# EasyEDA Pro project easyedapro_openstm.epro

# Schematic ControlBoard

## Sheets
1 P1: Create Date: 2023-06-15; Page Name: P1; Project Name: 扫描隧道显微镜OpenSTM; Schematic Name: ControlBoard; Update Date: 2023-06-15; Add into BOM: yes; Convert to PCB: yes
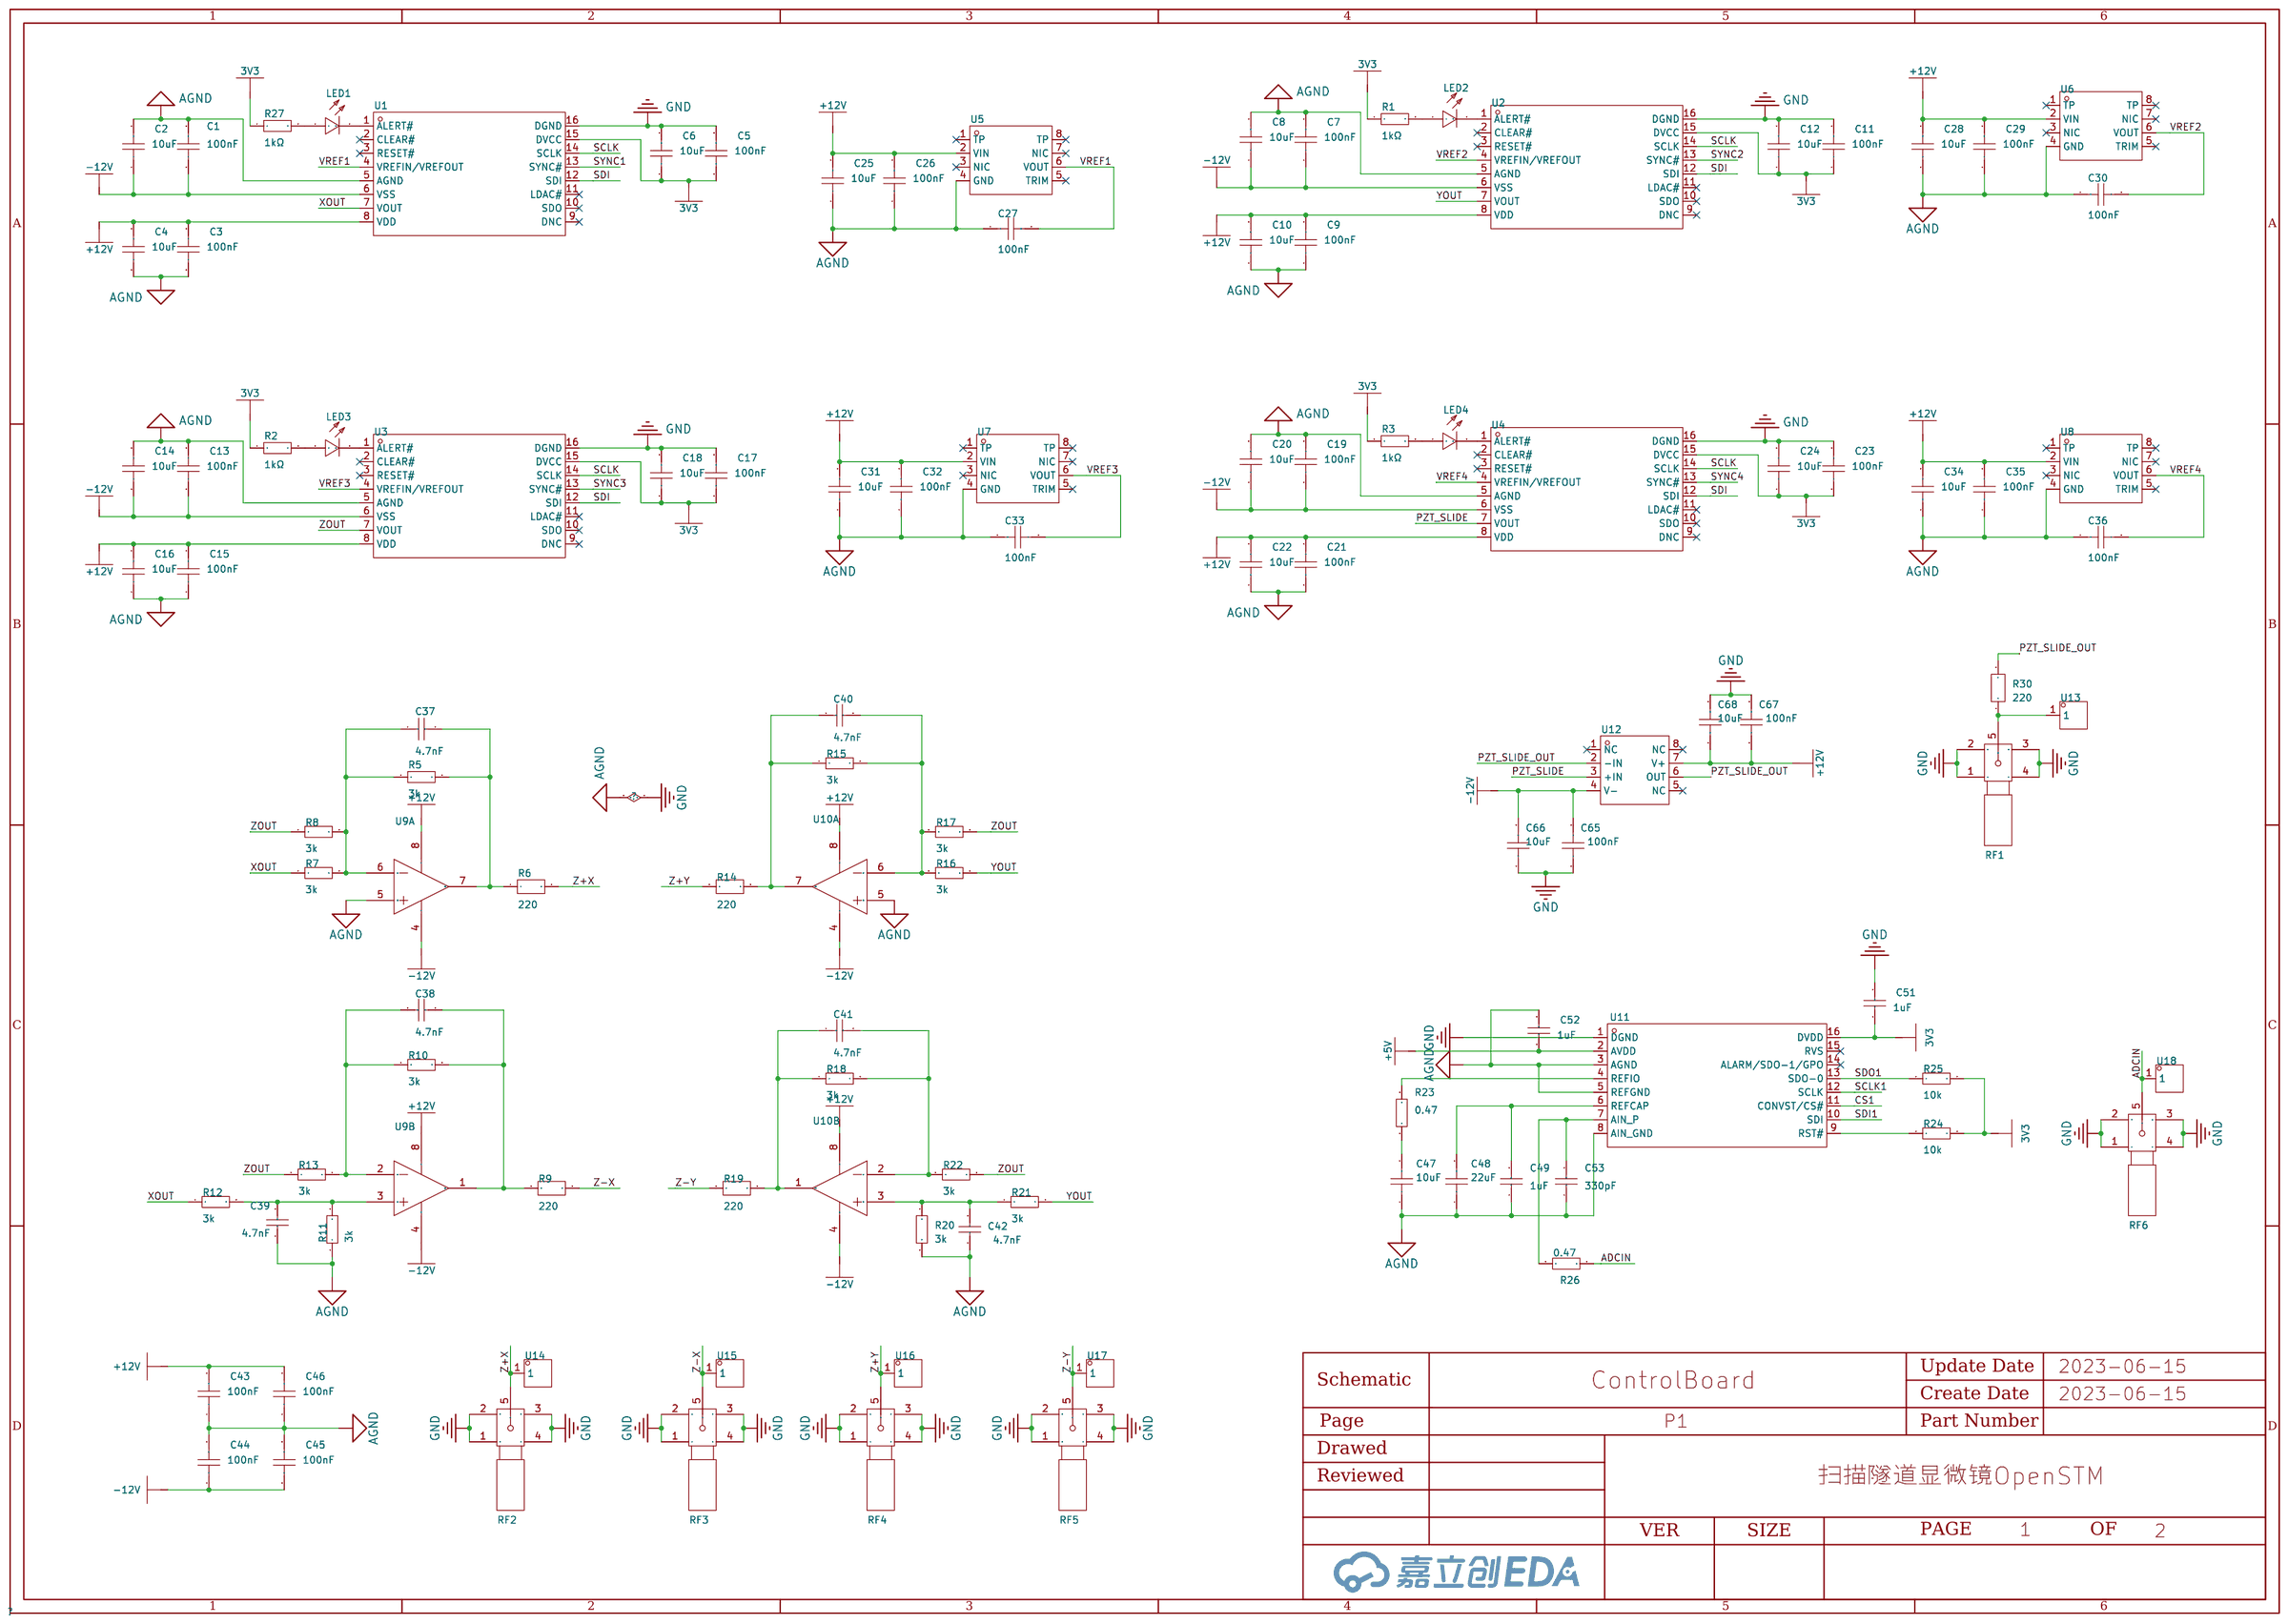
[diagram p0: P1]
2 P2: Create Date: 2022-03-08; Page Name: P2; Project Name: STM-New-Structure; Update Date: 2023-01-28
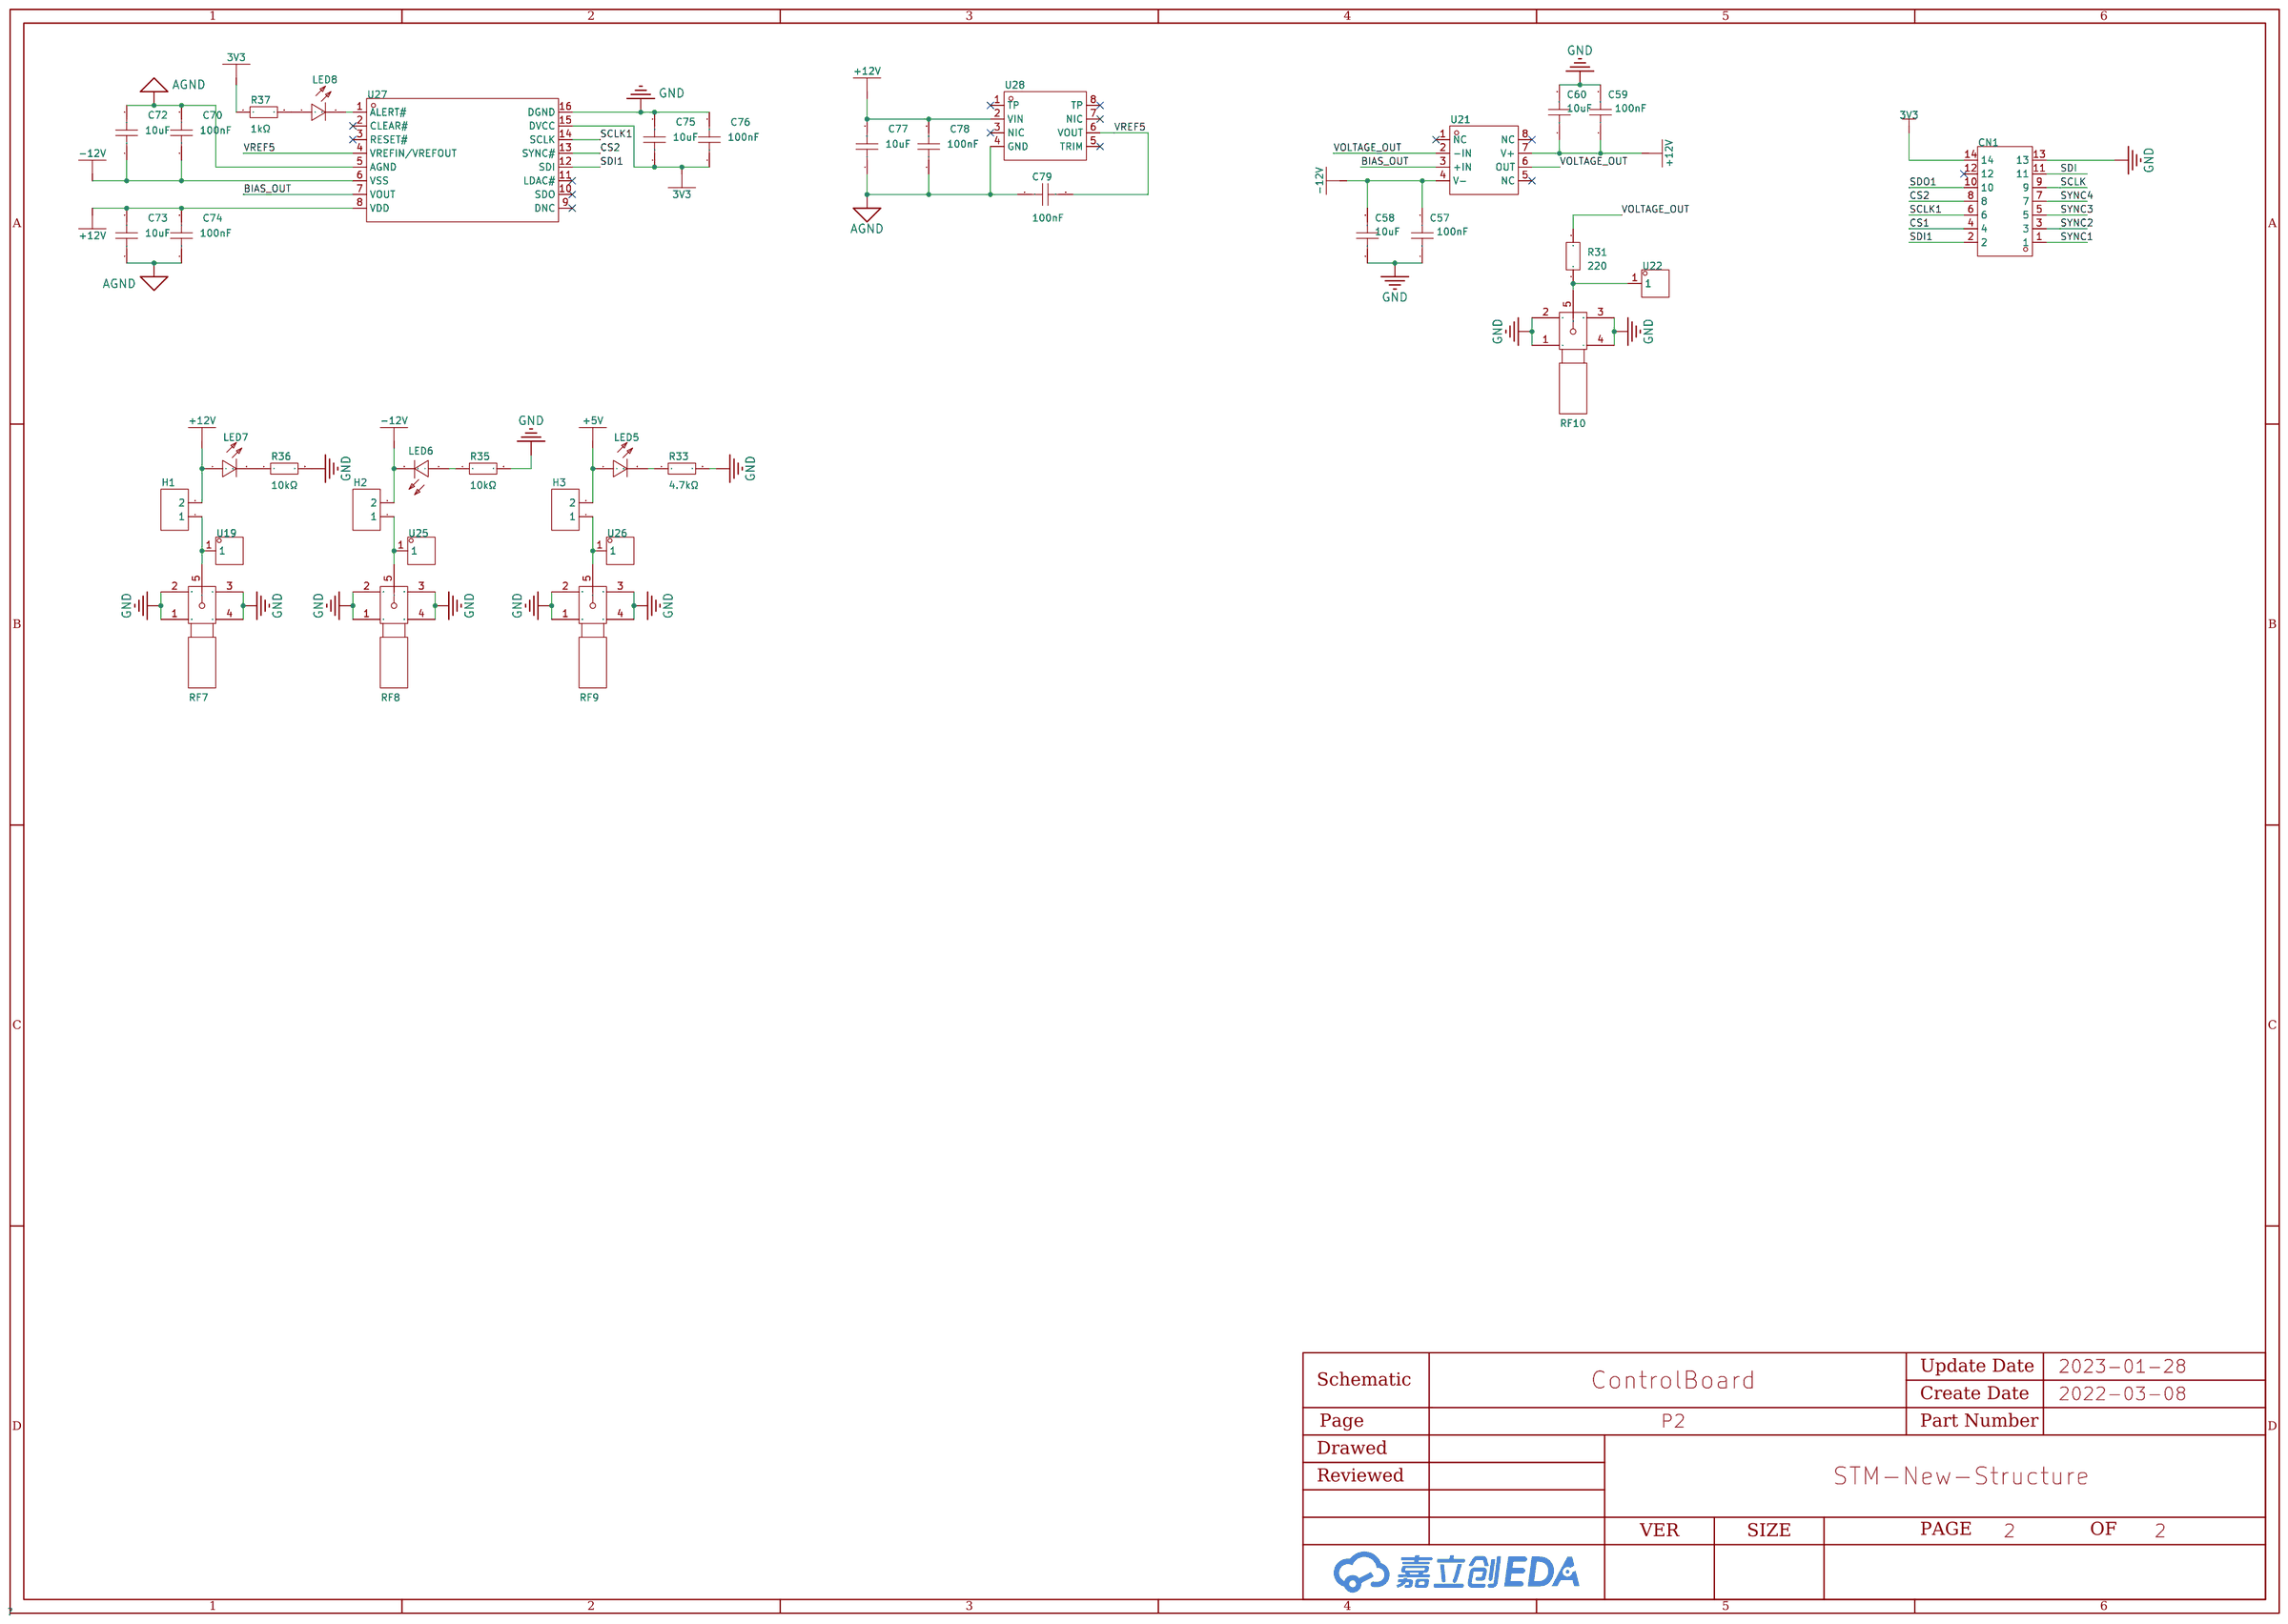
[diagram p1: P2]

## Parts
sheet P1
C1  100nF  [C0603]
C2  10uF  [C0603]
C3  100nF  [C0603]
C4  10uF  [C0603]
C5  100nF  [C0603]
C6  10uF  [C0603]
C7  100nF  [C0603]
C8  10uF  [C0603]
C9  100nF  [C0603]
C10  10uF  [C0603]
C11  100nF  [C0603]
C12  10uF  [C0603]
C13  100nF  [C0603]
C14  10uF  [C0603]
C15  100nF  [C0603]
C16  10uF  [C0603]
C17  100nF  [C0603]
C18  10uF  [C0603]
C19  100nF  [C0603]
C20  10uF  [C0603]
C21  100nF  [C0603]
C22  10uF  [C0603]
C23  100nF  [C0603]
C24  10uF  [C0603]
C25  10uF  [C0603]
C26  100nF  [C0603]
C27  100nF  [C0603]
C28  10uF  [C0603]
C29  100nF  [C0603]
C30  100nF  [C0603]
C31  10uF  [C0603]
C32  100nF  [C0603]
C33  100nF  [C0603]
C34  10uF  [C0603]
C35  100nF  [C0603]
C36  100nF  [C0603]
C37  4.7nF  [C0603]
C38  4.7nF  [C0603]
C39  4.7nF  [C0603]
C40  4.7nF  [C0603]
C41  4.7nF  [C0603]
C42  4.7nF  [C0603]
C43  100nF  [C0603]
C44  100nF  [C0603]
C45  100nF  [C0603]
C46  100nF  [C0603]
C47  10uF  [C0603]
C48  22uF  [C0603]
C49  1uF  [C0603]
C51  1uF  [C0603]
C52  1uF  [C0603]
C53  330pF  [C0603]
C65  100nF  [C0603]
C66  10uF  [C0603]
C67  100nF  [C0603]
C68  10uF  [C0603]
LED1  -  [LED0603-R-RD]
LED2  -  [LED0603-R-RD]
LED3  -  [LED0603-R-RD]
LED4  -  [LED0603-R-RD]
R1  1kΩ  [R0603]
R2  1kΩ  [R0603]
R3  1kΩ  [R0603]
R5  3k  [R0603]
R6  220  [R0603]
R7  3k  [R0603]
R8  3k  [R0603]
R9  220  [R0603]
R10  3k  [R0603]
R11  3k  [R0603]
R12  3k  [R0603]
R13  3k  [R0603]
R14  220  [R0603]
R15  3k  [R0603]
R16  3k  [R0603]
R17  3k  [R0603]
R18  3k  [R0603]
R19  220  [R0603]
R20  3k  [R0603]
R21  3k  [R0603]
R22  3k  [R0603]
R23  0.47  [R0603]
R24  10k  [R0603]
R25  10k  [R0603]
R26  0.47  [R0603]
R27  1kΩ  [R0603]
R30  220  [R0603]
RF1  -  [SMA-TH_KH-SMA-KE-Z]
RF2  -  [SMA-TH_KH-SMA-KE-Z]
RF3  -  [SMA-TH_KH-SMA-KE-Z]
RF4  -  [SMA-TH_KH-SMA-KE-Z]
RF5  -  [SMA-TH_KH-SMA-KE-Z]
RF6  -  [SMA-TH_KH-SMA-KE-Z]
U1  -  [TSSOP-16_L5.0-W4.4-P0.65-LS6.4-TL]
U2  -  [TSSOP-16_L5.0-W4.4-P0.65-LS6.4-TL]
U3  -  [TSSOP-16_L5.0-W4.4-P0.65-LS6.4-TL]
U4  -  [TSSOP-16_L5.0-W4.4-P0.65-LS6.4-TL]
U5  -  [SOIC-8_L4.9-W3.9-P1.27-LS6.0-BL]
U6  -  [SOIC-8_L4.9-W3.9-P1.27-LS6.0-BL]
U7  -  [SOIC-8_L4.9-W3.9-P1.27-LS6.0-BL]
U8  -  [SOIC-8_L4.9-W3.9-P1.27-LS6.0-BL]
U9  -  [SOIC-8_L4.9-W3.9-P1.27-LS6.0-BL]  (sections 1,2)
U10  -  [SOIC-8_L4.9-W3.9-P1.27-LS6.0-BL]  (sections 1,2)
U11  -  [TSSOP-16_L5.0-W4.4-P0.65-LS6.4-TL]
U12  -  [SOIC-8_L4.9-W3.9-P1.27-LS6.0-BL]
U13  -  [TEST-SMD_L2.7-W1.0]
U14  -  [TEST-SMD_L2.7-W1.0]
U15  -  [TEST-SMD_L2.7-W1.0]
U16  -  [TEST-SMD_L2.7-W1.0]
U17  -  [TEST-SMD_L2.7-W1.0]
U18  -  [TEST-SMD_L2.7-W1.0]
sheet P2
C57  100nF  [C0603]
C58  10uF  [C0603]
C59  100nF  [C0603]
C60  10uF  [C0603]
C70  100nF  [C0603]
C72  10uF  [C0603]
C73  10uF  [C0603]
C74  100nF  [C0603]
C75  10uF  [C0603]
C76  100nF  [C0603]
C77  10uF  [C0603]
C78  100nF  [C0603]
C79  100nF  [C0603]
CN1  X9555WR-2x07-6TV01  [CONN-TH_14P-P2.54_XKB_X9555WR-2X7-6TV01]
H1  -  [HDR-TH_2P-P2.54-V-F]
H2  -  [HDR-TH_2P-P2.54-V-F]
H3  -  [HDR-TH_2P-P2.54-V-F]
LED5  -  [LED0603-R-RD]
LED6  -  [LED0603-R-RD]
LED7  -  [LED0603-R-RD]
LED8  -  [LED0603-R-RD]
R31  220  [R0603]
R33  4.7kΩ  [R0603]
R35  10kΩ  [R0603]
R36  10kΩ  [R0603]
R37  1kΩ  [R0603]
RF7  -  [SMA-TH_KH-SMA-KE-Z]
RF8  -  [SMA-TH_KH-SMA-KE-Z]
RF9  -  [SMA-TH_KH-SMA-KE-Z]
RF10  -  [SMA-TH_KH-SMA-KE-Z]
U19  -  [TEST-SMD_L2.7-W1.0]
U21  AD8671ARZ-REEL7  [SOIC-8_L4.9-W3.9-P1.27-LS6.0-BL]
U22  -  [TEST-SMD_L2.7-W1.0]
U25  -  [TEST-SMD_L2.7-W1.0]
U26  -  [TEST-SMD_L2.7-W1.0]
U27  AD5721RBRUZ-RL7  [TSSOP-16_L5.0-W4.4-P0.65-LS6.4-BL]
U28  -  [SOIC-8_L4.9-W3.9-P1.27-LS6.0-BL]

## Library data of the parts
C1 C3 C5 C7 C9 C11 C13 C15 C17 C19 C21 C23 C26 C27 C29 C30 C32 C33 C35 C36 C43-C46 C57 C59 C65 C67 C70 C74 C76 C78 C79 = CL10B104KA8NNNC: 容值:100nF;精度:±10%;额定电压:25V;温度系数:X7R;; LCSC Part Name: 100nF±10%25V; Supplier Part: C1590; Manufacturer: SAMSUNG(三星); Supplier Footprint: 0603; JLCPCB Part Class: ExtendedPart; Datasheet: https://atta.szlcsc.com/upload/public/pdf/source/20160103/1457707680294.pdf; Supplier: LCSC; Tolerance: ±10%; Voltage Rated: 25V; Temperature Coefficient: X7R
C2 C4 C6 C8 C10 C12 C14 C16 C18 C20 C22 C24 C25 C28 C31 C34 C47 C58 C60 C66 C68 C72 C73 C75 C77 = GRM188R61E106MA73D: 容值:10uF;精度:±20%;额定电压:25V;温度系数:X5R;; LCSC Part Name: 10uF±20%25V; Supplier Part: C91606; Manufacturer: muRata(村田); Supplier Footprint: 0603; JLCPCB Part Class: ExtendedPart; Datasheet: https://atta.szlcsc.com/upload/public/pdf/source/20161226/1482720176185.pdf; Supplier: LCSC; Tolerance: ±20%; Voltage Rated: 25V; Temperature Coefficient: X5R
C37-C42 = 0603B472K500NT: 容值:4.7nF;精度:±10%;额定电压:50V;材质(温度系数):X7R;; LCSC Part Name: 4.7nF±10%50V; Supplier Part: C53987; Manufacturer: FH(风华); Supplier Footprint: 0603; JLCPCB Part Class: BasicPart; Datasheet: https://atta.szlcsc.com/upload/public/pdf/source/20170923/C53987_1506149489951988835.pdf; Supplier: LCSC; Tolerance: ±10%; Voltage Rated: 50V; Temperature Coefficient: X7R
C48 = CL10A226MP8NUNE: 容值:22uF;精度:±20%;额定电压:10V;温度系数:X5R;; LCSC Part Name: 22uF±20%10V; Supplier Part: C86295; Manufacturer: SAMSUNG(三星); Supplier Footprint: 0603; JLCPCB Part Class: ExtendedPart; Datasheet: https://atta.szlcsc.com/upload/public/pdf/source/20170325/1490427882169.pdf; Supplier: LCSC; Tolerance: ±20%; Voltage Rated: 10V; Temperature Coefficient: X5R
C49 C51 C52 = CL10A105KA8NNNC: 容值:1uF;精度:±10%;额定电压:25V;温度系数:X5R;; LCSC Part Name: 1uF±10%25V; Supplier Part: C5673; Manufacturer: SAMSUNG(三星); Supplier Footprint: 0603; JLCPCB Part Class: ExtendedPart; Datasheet: https://atta.szlcsc.com/upload/public/pdf/source/20160103/1457707739994.pdf; Supplier: LCSC; Tolerance: ±10%; Voltage Rated: 25V; Temperature Coefficient: X5R
C53 = CL10C331JB8NNNC: 容值:330pF;精度:±5%;额定电压:50V;温度系数:C0G;; LCSC Part Name: 330pF±5%50V; Supplier Part: C1664; Manufacturer: SAMSUNG(三星); Supplier Footprint: 0603; JLCPCB Part Class: BasicPart; Datasheet: https://atta.szlcsc.com/upload/public/pdf/source/20160103/1457707688612.pdf; Supplier: LCSC; Tolerance: ±5%; Voltage Rated: 50V; Temperature Coefficient: C0G
LED1-LED8 = 19-217/R6C-AL1M2VY/3T: 发光颜色:红灯;二极管配置:-;透镜颜色:无色透明;主波长:617.5nm;峰值波长:632nm;色温:-;光通量(25时):-;测试电流:5mA;正向电压(VF):2.2V;发光强度:28.5mcd;功率:60mW;发光角度:120°;安装方式:-;工作温度:-40~+85;; LCSC Part Name: 0603红灯; Supplier Part: C72044; Manufacturer: EVERLIGHT(台湾亿光); Supplier Footprint: 0603; JLCPCB Part Class: ExtendedPart; Datasheet: https://atta.szlcsc.com/upload/public/pdf/source/20160507/1462613613821.pdf; Supplier: LCSC; Emitted Color: 红灯; Lens Color: 无色透明; Dominant Wavelength: 617.5nm; Peak Wavelength: 632nm; Forward Current: 5mA; Forward Voltage (VF): 2.2V; Luminous Intensity: 28.5mcd; Power Dissipation: 60mW; Viewing Angle: 120°; Operating Temperature: -40~+85
R1-R3 R27 R37 = 0603WAF1001T5E: 电阻类型:厚膜电阻;阻值:1kΩ;精度:±1%;功率:100mW;温度系数:±100ppm/℃;最大工作电压:75V;工作温度范围:-55℃~+155℃;; LCSC Part Name: 1kΩ±1%100mW; Supplier Part: C21190; Manufacturer: UNI-ROYAL(厚声); Supplier Footprint: 0603; JLCPCB Part Class: BasicPart; Datasheet: https://atta.szlcsc.com/upload/public/pdf/source/20200306/C422600_1E6D84923E4A46A82E41ADD87F860B5C.pdf; Supplier: LCSC; Type: 厚膜电阻; Tolerance: ±1%; Power(Watts): 100mW; Temperature Coefficient: ±100ppm/℃; Overload Voltage (Max): 75V; Operating Temperature Range: -55℃~+155℃
R5 R7 R8 R10-R13 R15-R18 R20-R22 = ARG03DTC3001: 电阻类型:薄膜电阻;阻值:3k;精度:±0.5%;功率:100mW;温度系数:±25ppm/;最大工作电压:75V;工作温度范围:-55~+155;; LCSC Part Name: 3k ±0.5% 100mW; Supplier Part: C311916; Manufacturer: 光颉(Viking); Supplier Footprint: 0603; JLCPCB Part Class: ExtendedPart; Datasheet: https://atta.szlcsc.com/upload/public/pdf/source/20181119/C311916_083AB72433BF5B624DBE6C035DD51480.pdf; Supplier: LCSC; Type: 薄膜电阻; Tolerance: ±0.5%; Power(Watts): 100mW; Temperature Coefficient: ±25ppm/; Overload Voltage (Max): 75V; Operating Temperature Range: -55~+155
R6 R9 R14 R19 R30 R31 = ERJU3RD2200V: 阻值:220;精度:±0.5%;功率:100mW;温度系数:±50ppm/;最大工作电压:-;工作温度范围:-55~+155;; LCSC Part Name: 220 ±0.5% 100mW; Supplier Part: C491169; Manufacturer: PANASONIC(松下); Supplier Footprint: 0603; JLCPCB Part Class: ExtendedPart; Datasheet: https://atta.szlcsc.com/upload/public/pdf/source/20200407/C491169_AC2E94AF70820CF85EC0143B46F9F0DA.pdf; Supplier: LCSC; Tolerance: ±0.5%; Power(Watts): 100mW; Temperature Coefficient: ±50ppm/; Operating Temperature Range: -55~+155
R23 R26 = RL0603FR-070R47L: 阻值:0.47;精度:±1%;功率:100mW;温度系数:±800ppm/;; LCSC Part Name: 0.47 ±1% 100mW; Supplier Part: C326953; Manufacturer: YAGEO(国巨); Supplier Footprint: 0603; JLCPCB Part Class: ExtendedPart; Datasheet: https://atta.szlcsc.com/upload/public/pdf/source/20181031/C326953_2A06D5EACD581F8EE6DB7FFE6C5B8872.pdf; Supplier: LCSC; Tolerance: ±1%; Power(Watts): 100mW; Temperature Coefficient: ±800ppm/
R24 R25 = 0603WAF1002T5E: 电阻类型:厚膜电阻;阻值:10k;精度:±1%;功率:1/10W;温度系数:±100ppm/;最大工作电压:75V;工作温度范围:-55~+155;; LCSC Part Name: 10k ±1%; Supplier Part: C25804; Manufacturer: UNI-ROYAL(厚声); Supplier Footprint: 0603; JLCPCB Part Class: BasicPart; Datasheet: https://atta.szlcsc.com/upload/public/pdf/source/20200306/C422600_1E6D84923E4A46A82E41ADD87F860B5C.pdf; Supplier: LCSC; Type: 厚膜电阻; Tolerance: ±1%; Power(Watts): 1/10W; Temperature Coefficient: ±100ppm/; Overload Voltage (Max): 75V; Operating Temperature Range: -55~+155
RF1-RF10 = KH-SMA-KE-Z: 连接器类型:板端;射频系列:SMA;接口类型:内孔;端口数量:1;阻抗:-;频率-最大值:-;样式:正脚;接口直径:6.2mm;接口长度/高度:8mm;工作温度范围:-;; LCSC Part Name: SMA内孔正脚镀金半牙H=8MM; Supplier Part: C504007; Manufacturer: kinghelm(金航标); Supplier Footprint: 插件; JLCPCB Part Class: ExtendedPart; Datasheet: https://atta.szlcsc.com/upload/public/pdf/source/20200330/C504007_C31FA59B5EDC95FA4ACB3324B1A20151.pdf; Supplier: LCSC; Connector Type: 板端; RF Series: SMA; Interface Type: 内孔; Number of Ports: 1; Style: 正脚; Interface Diameter: 6.2mm; Interface Length/Height: 8mm
U1-U4 = AD5761RBRUZ: D/A位数:-;D/A通道数:-;输出类型:-;读写接口类型:-;; Supplier Part: C404015; Manufacturer: ADI(亚德诺)/LINEAR; Supplier Footprint: TSSOP-16; JLCPCB Part Class: ExtendedPart; Datasheet: https://atta.szlcsc.com/upload/public/pdf/source/20190722/C404015_21C88E48C88813C7B0010A18F7ED8816.pdf; Supplier: LCSC
U5-U8 U28 = ADR421BRZ-REEL: Supplier Part: C496503; Manufacturer: ADI(亚德诺)/LINEAR; Supplier Footprint: SOIC-8; JLCPCB Part Class: ExtendedPart; Datasheet: https://atta.szlcsc.com/upload/public/pdf/source/20200316/C496503_A1F080746FA87D9455D96FF2B5AA62EC.pdf; Supplier: LCSC
U9 U10 = OPA2227UA/2K5: 运放类型:GeneralPurpose;放大器组数:2;增益带宽积（GBP）:8MHz;压摆率（SR）:2.3V/us;电源电压:5V~36V,±2.5V~18V;各通道供电电流:3.7mA;; Supplier Part: C19308; Manufacturer: TI(德州仪器); Supplier Footprint: SOIC-8_150mil; JLCPCB Part Class: ExtendedPart; Datasheet: https://atta.szlcsc.com/upload/public/pdf/source/20130925/1457706650838.pdf; Supplier: LCSC; Amplifier Type: GeneralPurpose; Number of Circuits: 2; Gain Bandwidth Product（GBP）: 8MHz; Slew Rate（SR）: 2.3V/us; Supply Voltage（Single）: 5V~36V,±2.5V~18V; Iq per channel (Typ): 3.7mA
U11 = ADS8685IPWR: A/D位数:-;采样率（sps）:-;输入数:-;输入类型:-;; Supplier Part: C2669941; Manufacturer: TI(德州仪器); Supplier Footprint: TSSOP-16; JLCPCB Part Class: ExtendedPart; Supplier: LCSC
U12 U21 = AD8671ARZ-REEL7: 运放类型:GeneralPurpose;放大器组数:1;增益带宽积（GBP）:10MHz;压摆率（SR）:4V/us;电源电压:10V~36V,±5V~18V;各通道供电电流:3mA;; Supplier Part: C56309; Manufacturer: ADI(亚德诺)/LINEAR; Supplier Footprint: SOIC-8_150mil; JLCPCB Part Class: ExtendedPart; Datasheet: https://atta.szlcsc.com/upload/public/pdf/source/20150821/1457707348731.pdf; Supplier: LCSC; Amplifier Type: GeneralPurpose; Number of Circuits: 1; Gain Bandwidth Product（GBP）: 10MHz; Slew Rate（SR）: 4V/us; Supply Voltage（Single）: 10V~36V,±5V~18V; Iq per channel (Typ): 3mA; Operating Temperature: -40°C~125°C
U13-U19 U22 U25 U26 = 5017: 连接器类型:测试点/测试环;颜色:-;; LCSC Part Name: 测试点/测试环; Supplier Part: C238130; Manufacturer: Keystone; JLCPCB Part Class: ExtendedPart; Datasheet: https://atta.szlcsc.com/upload/public/pdf/source/20180629/C238130_5A26801579F58754781F264880A43AC8.PDF; Supplier: LCSC; Connector Type: 测试点/测试环
CN1 = X9555WR-2x07-6TV01: 参考系列:-;间距:2.54mm;插针结构:2x7P;排数:2;每排PIN数:7;行距:2.54mm;公母:公型插针;安装方式:弯插;额定电流:3A;触头材质:黄铜;触头镀层:金;工作温度范围:-25℃~+85℃;焊接温度(最大值):260℃;; LCSC Part Name: 2.54mm2x7P弯插; Supplier Part: C2884505; Manufacturer: XKBConnectivity(中国星坤); Supplier Footprint: 弯插,P=2.54mm; JLCPCB Part Class: ExtendedPart; Datasheet: https://atta.szlcsc.com/upload/public/pdf/source/20211009/ED69AC5D0B165AFEE3838F4DF324EF6E.pdf; Supplier: LCSC; Pitch: 2.54mm; Pins Structure: 2x7P; Number of Rows: 2; Number of PINs Per Row: 7; Row Spacing: 2.54mm; Gender: 公型插针; Mounting Style: 弯插; Current Rating (Max): 3A; Contact Material: 黄铜; Contact Plating: 金; Operating Temperature Range: -25℃~+85℃; Welding Temperature (Max): 260℃
H1-H3 = HDR-F_2.54_1x2P: Supplier Part: C49661; Supplier Footprint: 插件
R33 = 0603WAF4701T5E: 电阻类型:厚膜电阻;阻值:4.7kΩ;精度:±1%;功率:100mW;温度系数:±100ppm/℃;最大工作电压:75V;工作温度范围:-55℃~+155℃;; LCSC Part Name: 4.7kΩ±1%100mW; Supplier Part: C23162; Manufacturer: UNI-ROYAL(厚声); Supplier Footprint: 0603; JLCPCB Part Class: BasicPart; Datasheet: https://atta.szlcsc.com/upload/public/pdf/source/20200306/C422600_1E6D84923E4A46A82E41ADD87F860B5C.pdf; Supplier: LCSC; Type: 厚膜电阻; Tolerance: ±1%; Power(Watts): 100mW; Temperature Coefficient: ±100ppm/℃; Overload Voltage (Max): 75V; Operating Temperature Range: -55℃~+155℃
R35 R36 = 0603WAF1002T5E: 电阻类型:厚膜电阻;阻值:10kΩ;精度:±1%;功率:100mW;温度系数:±100ppm/℃;最大工作电压:75V;工作温度范围:-55℃~+155℃;; LCSC Part Name: 10kΩ±1%100mW; Supplier Part: C25804; Manufacturer: UNI-ROYAL(厚声); Supplier Footprint: 0603; JLCPCB Part Class: BasicPart; Datasheet: https://atta.szlcsc.com/upload/public/pdf/source/20200306/C422600_1E6D84923E4A46A82E41ADD87F860B5C.pdf; Supplier: LCSC; Type: 厚膜电阻; Tolerance: ±1%; Power(Watts): 100mW; Temperature Coefficient: ±100ppm/℃; Overload Voltage (Max): 75V; Operating Temperature Range: -55℃~+155℃
U27 = AD5721RBRUZ-RL7: Supplier Part: C2679721; Manufacturer: ADI(亚德诺)/LINEAR(凌特); Supplier Footprint: TSSOP-16; JLCPCB Part Class: ExtendedPart; Datasheet: https://atta.szlcsc.com/upload/public/pdf/source/20210603/ECE7F6A4264BD924F9063B284D4D4E62.pdf; Supplier: LCSC

## Nets
3V3: C5.1 C6.1 C11.1 C12.1 C17.1 C18.1 C23.1 C24.1 C51.1 C75.1 C76.1 CN1.14 R1.1 R2.1 R3.1 R24.2 R25.2 R27.1 R37.1 U1.15(DVCC) U2.15(DVCC) U3.15(DVCC) U4.15(DVCC) U11.16(DVDD) U27.15(DVCC)
+5V: C52.1 H3.2 LED5.1(A) U11.2(AVDD)
+12V: C3.2 C4.2 C9.2 C10.2 C15.2 C16.2 C21.2 C22.2 C25.2 C26.2 C28.2 C29.2 C31.2 C32.2 C34.2 C35.2 C43.2 C46.2 C59.1 C60.1 C67.1 C68.1 C73.2 C74.2 C77.2 C78.2 H1.2 LED7.1(A) U1.8(VDD) U2.8(VDD) U3.8(VDD) U4.8(VDD) U5.2(VIN) U6.2(VIN) U7.2(VIN) U8.2(VIN) U9.8(V+) U10.8(V+) U12.7(V+) U21.7(V+) U27.8(VDD) U28.2(VIN)
-12V: C1.1 C2.1 C7.1 C8.1 C13.1 C14.1 C19.1 C20.1 C44.1 C45.1 C57.2 C58.2 C65.2 C66.2 C70.1 C72.1 H2.2 LED6.2(C) U1.6(VSS) U2.6(VSS) U3.6(VSS) U4.6(VSS) U9.4(V-) U10.4(V-) U12.4(V-) U21.4(V-) U27.6(VSS)
AGND: C1.2 C2.2 C3.1 C4.1 C5.2 C6.2 C7.2 C8.2 C9.1 C10.1 C11.2 C12.2 C13.2 C14.2 C15.1 C16.1 C17.2 C18.2 C19.2 C20.2 C21.1 C22.1 C23.2 C24.2 C25.1 C26.1 C27.1 C28.1 C29.1 C30.1 C31.1 C32.1 C33.1 C34.1 C35.1 C36.1 C39.1 C42.2 C43.1 C44.2 C45.2 C46.1 C47.1 C48.1 C49.1 C51.2 C52.2 C53.1 C57.1 C58.1 C59.2 C60.2 C65.1 C66.1 C67.2 C68.2 C70.2 C72.2 C73.1 C74.1 C75.2 C76.2 C77.1 C78.1 C79.1 CN1.13 R11.1 R20.2 R33.2 R35.2 R36.2 RF1.1 RF1.2 RF1.3 RF1.4 RF2.1 RF2.2 RF2.3 RF2.4 RF3.1 RF3.2 RF3.3 RF3.4 RF4.1 RF4.2 RF4.3 RF4.4 RF5.1 RF5.2 RF5.3 RF5.4 RF6.1 RF6.2 RF6.3 RF6.4 RF7.1 RF7.2 RF7.3 RF7.4 RF8.1 RF8.2 RF8.3 RF8.4 RF9.1 RF9.2 RF9.3 RF9.4 RF10.1 RF10.2 RF10.3 RF10.4 U1.5(AGND) U1.16(DGND) U2.5(AGND) U2.16(DGND) U3.5(AGND) U3.16(DGND) U4.5(AGND) U4.16(DGND) U5.4(GND) U6.4(GND) U7.4(GND) U8.4(GND) U9.5(IN B+) U10.5(IN B+) U11.1(DGND) U11.3(AGND) U11.5(REFGND) U11.8(AIN_GND) U27.5(AGND) U27.16(DGND) U28.4(GND)
ADCIN: R26.2 RF6.5 U18.1
BIAS_OUT: U21.3(+IN) U27.7(VOUT)
CS1: CN1.4 U11.11(CONVST/CS#)
CS2: CN1.8 U27.13(SYNC#)
PZT_SLIDE: U4.7(VOUT) U12.3(+IN)
PZT_SLIDE_OUT: R30.2 U12.2(-IN) U12.6(OUT)
SCLK: CN1.9 U1.14(SCLK) U2.14(SCLK) U3.14(SCLK) U4.14(SCLK)
SCLK1: CN1.6 U11.12(SCLK) U27.14(SCLK)
SDI: CN1.11 U1.12(SDI) U2.12(SDI) U3.12(SDI) U4.12(SDI)
SDI1: CN1.2 U11.10(SDI) U27.12(SDI)
SDO1: CN1.10 R25.1 U11.13(SDO-0)
SYNC1: CN1.1 U1.13(SYNC#)
SYNC2: CN1.3 U2.13(SYNC#)
SYNC3: CN1.5 U3.13(SYNC#)
SYNC4: CN1.7 U4.13(SYNC#)
VOLTAGE_OUT: R31.2 U21.2(-IN) U21.6(OUT)
VREF1: C27.2 U1.4(VREFIN/VREFOUT) U5.6(VOUT)
VREF2: C30.2 U2.4(VREFIN/VREFOUT) U6.6(VOUT)
VREF3: C33.2 U3.4(VREFIN/VREFOUT) U7.6(VOUT)
VREF4: C36.2 U4.4(VREFIN/VREFOUT) U8.6(VOUT)
VREF5: C79.2 U27.4(VREFIN/VREFOUT) U28.6(VOUT)
XOUT: R7.1 R12.1 U1.7(VOUT)
YOUT: R16.2 R21.2 U2.7(VOUT)
Z+X: R6.2 RF2.5 U14.1
Z+Y: R14.1 RF4.5 U16.1
Z-X: R9.2 RF3.5 U15.1
Z-Y: R19.1 RF5.5 U17.1
ZOUT: R8.1 R13.1 R17.2 R22.2 U3.7(VOUT)
$1N1334: LED1.2(C) U1.1(ALERT#)
$1N4521: LED2.2(C) U2.1(ALERT#)
$1N6398: LED4.2(C) U4.1(ALERT#)
$1N6412: LED3.2(C) U3.1(ALERT#)
$1N17278: C37.2 R5.2 R6.1 U9.7(OUT B)
$1N17904: C37.1 R5.1 R7.2 R8.2 U9.6(IN B-)
$1N19975: C38.2 R9.1 R10.2 U9.1(OUT A)
$1N22239: C39.2 R11.2 R12.2 U9.3(IN A+)
$1N23370: C38.1 R10.1 R13.2 U9.2(IN A-)
$1N27431: C40.1 R14.2 R15.1 U10.7(OUT B)
$1N27675: C40.2 R15.2 R16.1 R17.1 U10.6(IN B-)
$1N29433: C41.1 R18.1 R19.2 U10.1(OUT A)
$1N29693: C41.2 R18.2 R22.1 U10.2(IN A-)
$1N31851: C42.1 R20.1 R21.1 U10.3(IN A+)
$1N44864: C47.2 R23.1
$1N45543: R23.2 U11.4(REFIO)
$1N48445: C48.2 C49.2 U11.6(REFCAP)
$1N53852: C53.2 R26.1 U11.7(AIN_P)
$1N55555: R24.1 U11.9(RST#)
$1N86130: LED1.1(A) R27.2
$1N86342: LED2.1(A) R1.2
$1N86554: LED3.1(A) R2.2
$1N86766: LED4.1(A) R3.2
$1N98330: R30.1 RF1.5 U13.1
$2N11015: R31.1 RF10.5 U22.1
$2N16241: H1.1 RF7.5 U19.1
$2N16244: H2.1 RF8.5 U25.1
$2N16819: H3.1 RF9.5 U26.1
$2N23862: LED5.2(C) R33.1
$2N24958: LED6.1(A) R35.1
$2N25511: LED7.2(C) R36.1
$2N27101: LED8.2(C) U27.1(ALERT#)
$2N28835: LED8.1(A) R37.2

Not connected (* = marked no-connect by the designer): CN1 12*; U1 2(CLEAR#)* 3(RESET#)* 9(DNC)* 10(SDO)* 11(LDAC#)*; U2 2(CLEAR#)* 3(RESET#)* 9(DNC)* 10(SDO)* 11(LDAC#)*; U3 2(CLEAR#)* 3(RESET#)* 9(DNC)* 10(SDO)* 11(LDAC#)*; U4 2(CLEAR#)* 3(RESET#)* 9(DNC)* 10(SDO)* 11(LDAC#)*; U5 1(TP)* 3(NIC)* 5(TRIM)* 7(NIC)* 8(TP)*; U6 1(TP)* 3(NIC)* 5(TRIM)* 7(NIC)* 8(TP)*; U7 1(TP)* 3(NIC)* 5(TRIM)* 7(NIC)* 8(TP)*; U8 1(TP)* 3(NIC)* 5(TRIM)* 7(NIC)* 8(TP)*; U11 14(ALARM/SDO-1/GPO)* 15(RVS)*; U12 1(NC)* 5(NC)* 8(NC)*; U21 1(NC)* 5(NC)* 8(NC)*; U27 2(CLEAR#)* 3(RESET#)* 9(DNC)* 10(SDO)* 11(LDAC#)*; U28 1(TP)* 3(NIC)* 5(TRIM)* 7(NIC)* 8(TP)*

# Board ControlBoard
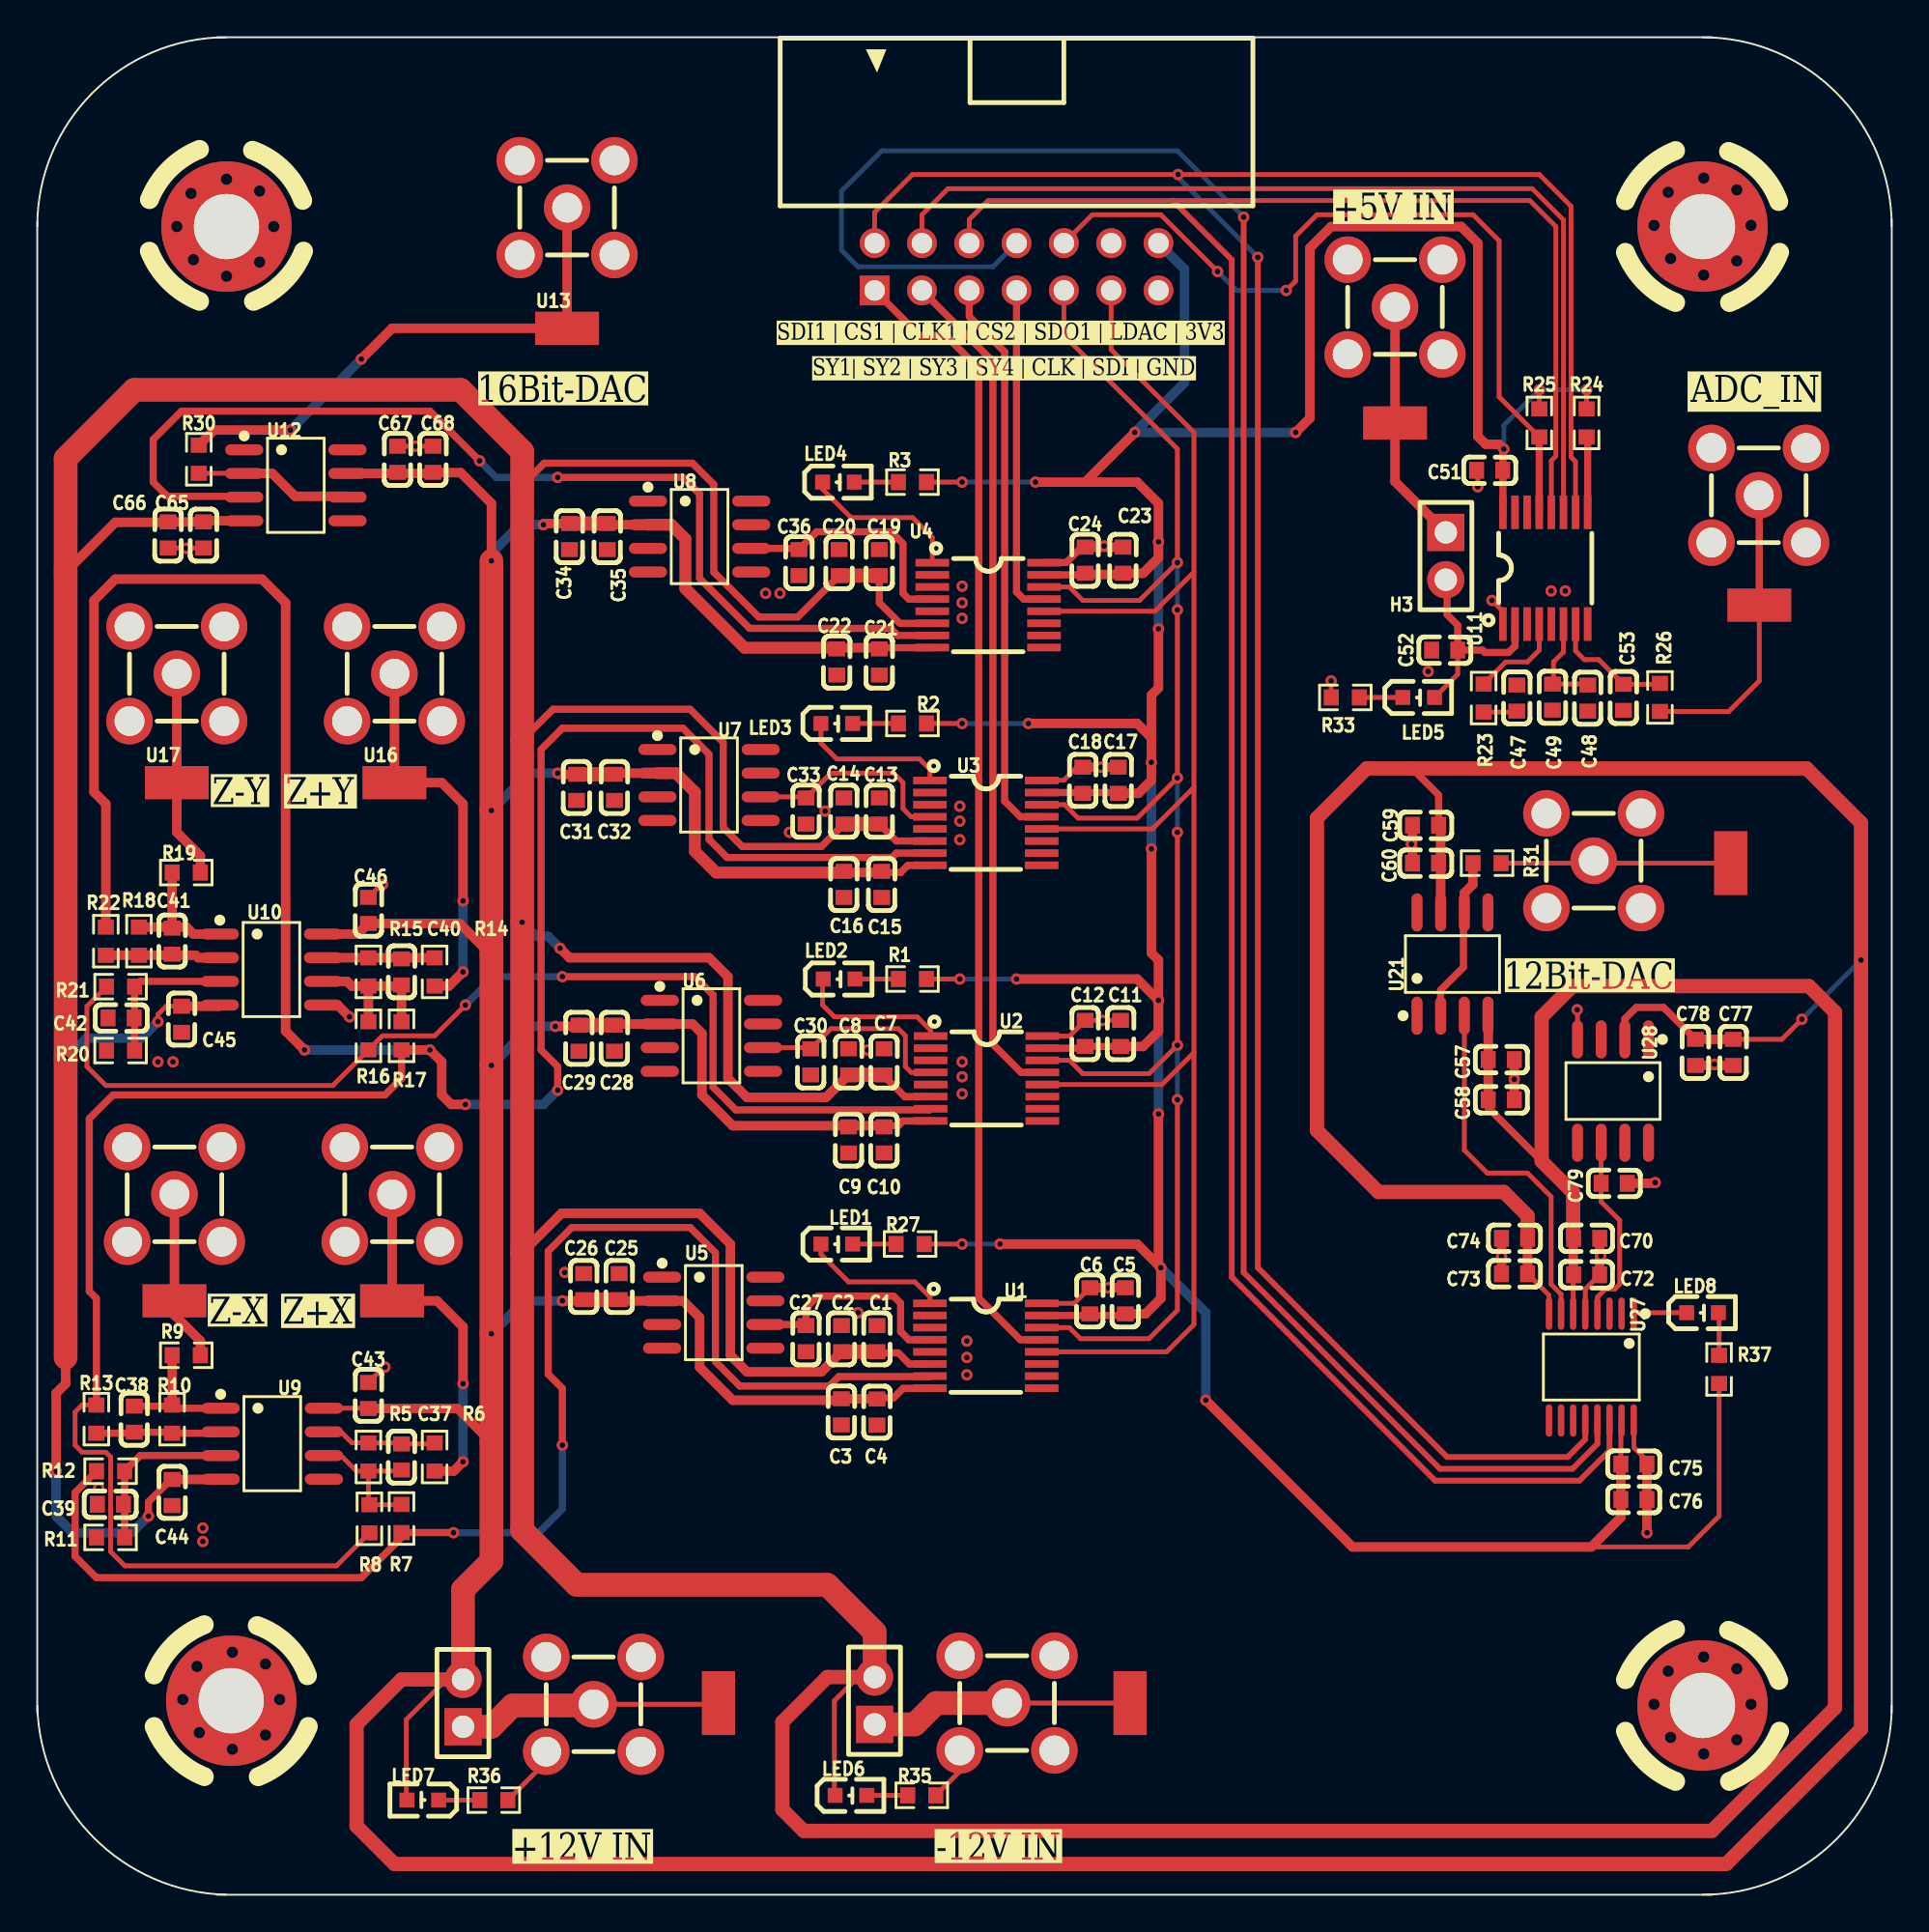
[diagram p2: board, top side]
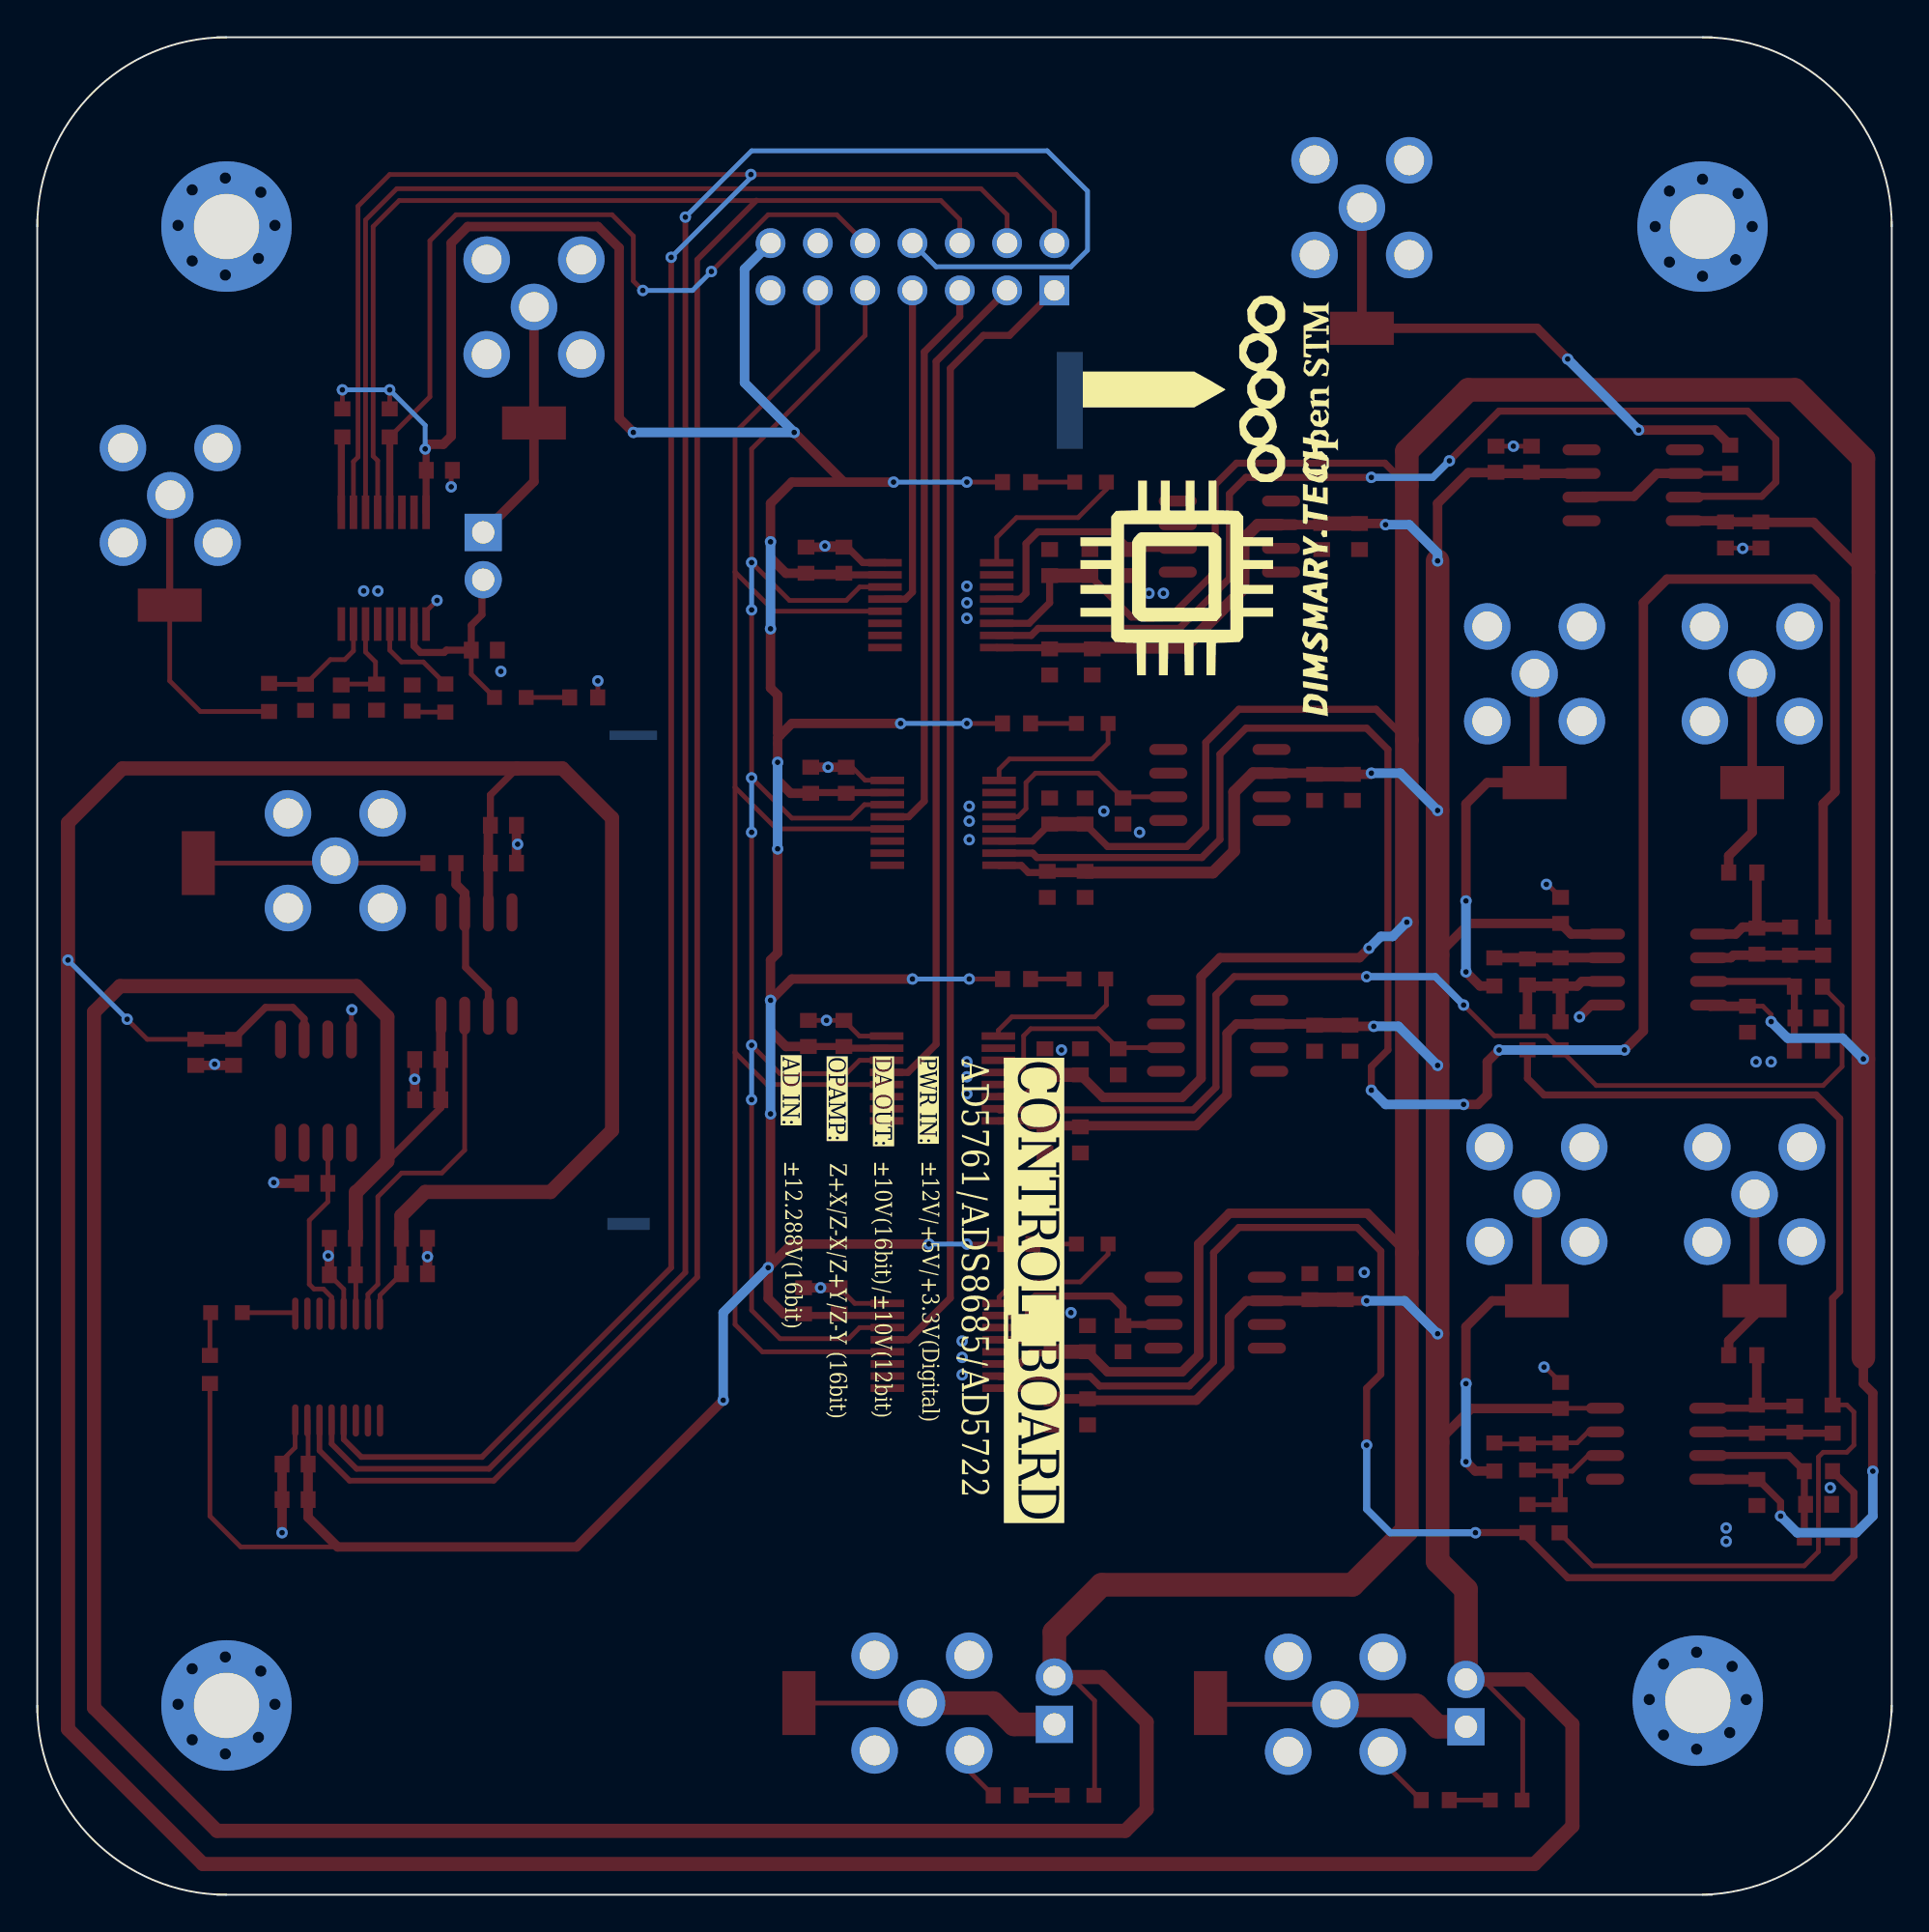
[diagram p3: board, bottom side, seen from below]

Outline 99.57 x 99.7 mm; copper layers: Top Layer, Bottom Layer. Coordinates in mm from the lower left corner of the outline.
Outline path: 0,89.54 arc(2.98,96.72) 10.16,99.7 ; 0,9.78 0,89.79 ; 9.65,99.7 89.92,99.7 ; 9.65,0 89.92,0 ; 10.16,0 arc(3.05,3.05) 0,10.16 ; 89.41,99.7 arc(96.59,96.72) 99.57,89.54 ; 99.57,10.16 arc(96.59,2.98) 89.41,0 ; 99.57,9.78 99.57,89.92
Stack: Top Layer 0.035mm / Dielectric1 1.51mm FR4 er 4.5 / Bottom Layer 0.035mm

## Design rules (mm)
spacing safeClearance (default): track to track 0.152, other pairs 0.152 to 0.3
track width trackWidth (default): min 0.127, default 0.254, max 2.54
differential pair differentialPair (default): width min 0.127, default 0.254, max 2.54; gap min 0.152, default 0.152
via viaSize (default): diameter min 0.5, default 0.61, max 10; hole min 0.3, default 0.305, max 6

## Placement (name value [footprint] x y rotation side)
C1  100nF  [C0603]  45.09 29.85 90 top
C2  10uF  [C0603]  43.18 29.85 90 top
C3  100nF  [C0603]  43.18 25.92 90 top
C4  10uF  [C0603]  45.09 25.91 90 top
C5  100nF  [C0603]  58.42 31.88 90 top
C6  10uF  [C0603]  56.51 31.88 90 top
C7  100nF  [C0603]  45.47 44.7 90 top
C8  10uF  [C0603]  43.56 44.7 90 top
C9  100nF  [C0603]  43.56 40.51 90 top
C10  10uF  [C0603]  45.47 40.51 90 top
C11  100nF  [C0603]  58.17 46.23 90 top
C12  10uF  [C0603]  56.26 46.23 90 top
C13  100nF  [C0603]  45.21 58.17 90 top
C14  10uF  [C0603]  43.31 58.17 90 top
C15  100nF  [C0603]  45.34 54.23 90 top
C16  10uF  [C0603]  43.31 54.23 90 top
C17  100nF  [C0603]  58.04 59.82 90 top
C18  10uF  [C0603]  56.13 59.82 90 top
C19  100nF  [C0603]  45.21 71.5 90 top
C20  10uF  [C0603]  43.05 71.5 90 top
C21  100nF  [C0603]  45.21 66.17 90 top
C22  10uF  [C0603]  42.93 66.17 90 top
C23  100nF  [C0603]  58.29 71.63 90 top
C24  10uF  [C0603]  56.26 71.63 90 top
C25  10uF  [C0603]  31.24 32.64 270 top
C26  100nF  [C0603]  29.34 32.64 270 top
C27  100nF  [C0603]  41.28 29.85 90 top
C28  10uF  [C0603]  30.99 45.97 90 top
C29  100nF  [C0603]  29.08 45.97 90 top
C30  100nF  [C0603]  41.53 44.7 90 top
C31  10uF  [C0603]  28.96 59.44 90 top
C32  100nF  [C0603]  30.99 59.44 90 top
C33  100nF  [C0603]  41.28 58.17 90 top
C34  10uF  [C0603]  28.57 72.9 90 top
C35  100nF  [C0603]  30.61 72.9 90 top
C36  100nF  [C0603]  40.89 71.5 90 top
C37  4.7nF  [C0603]  19.56 23.5 90 top
C38  4.7nF  [C0603]  5.21 25.53 90 top
C39  4.7nF  [C0603]  3.93 20.95 0 top
C40  4.7nF  [C0603]  19.56 49.53 270 top
C41  4.7nF  [C0603]  7.24 51.18 270 top
C42  4.7nF  [C0603]  4.5 47.06 180 top
C43  100nF  [C0603]  17.78 26.8 270 top
C44  100nF  [C0603]  7.24 21.59 270 top
C45  100nF  [C0603]  7.75 46.99 270 top
C46  100nF  [C0603]  17.78 52.83 270 top
C47  10uF  [C0603]  79.44 64.23 270 top
C48  22uF  [C0603]  83.25 64.23 90 top
C49  1uF  [C0603]  81.35 64.28 90 top
C51  1uF  [C0603]  77.98 76.45 180 top
C52  1uF  [C0603]  75.56 66.8 180 top
C53  330pF  [C0603]  85.16 64.27 90 top
C57  100nF  [C0603]  78.6 44.83 180 top
C58  10uF  [C0603]  78.6 42.67 180 top
C59  100nF  [C0603]  74.54 57.4 180 top
C60  10uF  [C0603]  74.54 55.37 180 top
C65  100nF  [C0603]  8.93 72.98 90 top
C66  10uF  [C0603]  7.02 72.98 90 top
C67  100nF  [C0603]  19.34 77.05 90 top
C68  10uF  [C0603]  21.25 77.05 90 top
C70  100nF  [C0603]  83.19 35.23 0 top
C72  10uF  [C0603]  83.19 33.27 0 top
C73  10uF  [C0603]  79.32 33.33 0 top
C74  100nF  [C0603]  79.32 35.23 0 top
C75  10uF  [C0603]  85.72 23.11 0 top
C76  100nF  [C0603]  85.72 21.21 0 top
C77  10uF  [C0603]  91.06 45.21 90 top
C78  100nF  [C0603]  89.03 45.21 90 top
C79  100nF  [C0603]  84.67 38.18 180 top
CN1  X9555WR-2x07-6TV01  [CONN-TH_14P-P2.54_XKB_X9555WR-2X7-6TV01]  52.58 87.38 180 top
H1  -  [HDR-TH_2P-P2.54-V-F]  22.86 10.29 90 top
H2  -  [HDR-TH_2P-P2.54-V-F]  44.96 10.41 90 top
H3  -  [HDR-TH_2P-P2.54-V-F]  75.63 71.85 270 top
LED1  -  [LED0603-R-RD]  42.93 34.93 0 top
LED2  -  [LED0603-R-RD]  43.05 49.15 0 top
LED3  -  [LED0603-R-RD]  42.93 62.87 0 top
LED4  -  [LED0603-R-RD]  43.01 75.82 0 top
LED5  -  [LED0603-R-RD]  74.17 64.26 0 top
LED6  -  [LED0603-R-RD]  43.69 5.33 0 top
LED7  -  [LED0603-R-RD]  20.7 5.08 180 top
LED8  -  [LED0603-R-RD]  89.41 31.24 0 top
NOREF  -  [Pad_e761]  10.16 89.54 0 top
NOREF#2  -  [Pad_e757]  89.41 89.54 0 top
NOREF#3  -  [Pad_e762]  10.41 10.41 0 top
NOREF#4  -  [Pad_e763]  89.41 10.16 0 top
R1  1kΩ  [R0603]  46.99 49.15 180 top
R2  1kΩ  [R0603]  46.99 62.87 180 top
R3  1kΩ  [R0603]  46.99 75.82 180 top
R5  3k  [R0603]  17.78 23.5 90 top
R6  220  [R0603]  21.34 23.5 270 top
R7  3k  [R0603]  19.56 20.19 90 top
R8  3k  [R0603]  17.83 20.18 90 top
R9  220  [R0603]  8 28.96 0 top
R10  3k  [R0603]  7.24 25.53 90 top
R11  3k  [R0603]  3.94 19.18 0 top
R12  3k  [R0603]  3.94 22.73 0 top
R13  3k  [R0603]  3.17 25.53 270 top
R14  220  [R0603]  21.34 49.53 90 top
R15  3k  [R0603]  17.78 49.53 270 top
R16  3k  [R0603]  17.78 46.1 270 top
R17  3k  [R0603]  19.56 46.1 270 top
R18  3k  [R0603]  5.46 51.18 270 top
R19  220  [R0603]  8 54.86 180 top
R20  3k  [R0603]  4.47 45.31 180 top
R21  3k  [R0603]  4.47 48.74 180 top
R22  3k  [R0603]  3.68 51.18 90 top
R23  0.47  [R0603]  77.66 64.23 90 top
R24  10k  [R0603]  83.19 78.99 90 top
R25  10k  [R0603]  80.65 78.99 90 top
R26  0.47  [R0603]  87.12 64.26 270 top
R27  1kΩ  [R0603]  46.86 34.93 180 top
R30  220  [R0603]  8.68 77.05 270 top
R31  220  [R0603]  77.84 55.37 180 top
R33  4.7kΩ  [R0603]  70.23 64.26 180 top
R35  10kΩ  [R0603]  47.49 5.33 0 top
R36  10kΩ  [R0603]  24.51 5.08 0 top
R37  1kΩ  [R0603]  90.3 28.19 90 top
RF1  -  [SMA-TH_KH-SMA-KE-Z]  28.45 90.55 0 top
RF2  -  [SMA-TH_KH-SMA-KE-Z]  19.05 37.59 0 top
RF3  -  [SMA-TH_KH-SMA-KE-Z]  7.37 37.59 0 top
RF4  -  [SMA-TH_KH-SMA-KE-Z]  19.18 65.53 0 top
RF5  -  [SMA-TH_KH-SMA-KE-Z]  7.49 65.53 0 top
RF6  -  [SMA-TH_KH-SMA-KE-Z]  92.43 75.11 0 top
RF7  -  [SMA-TH_KH-SMA-KE-Z]  29.87 10.22 0 top
RF8  -  [SMA-TH_KH-SMA-KE-Z]  52.07 10.29 0 top
RF9  -  [SMA-TH_KH-SMA-KE-Z]  72.9 85.22 90 top
RF10  -  [SMA-TH_KH-SMA-KE-Z]  83.57 55.5 270 top
U1  -  [TSSOP-16_L5.0-W4.4-P0.65-LS6.4-TL]  50.93 29.46 0 top
U2  -  [TSSOP-16_L5.0-W4.4-P0.65-LS6.4-TL]  50.96 43.81 0 top
U3  -  [TSSOP-16_L5.0-W4.4-P0.65-LS6.4-TL]  50.93 57.53 0 top
U4  -  [TSSOP-16_L5.0-W4.4-P0.65-LS6.4-TL]  51.05 69.22 0 top
U5  -  [SOIC-8_L4.9-W3.9-P1.27-LS6.0-BL]  36.32 31.24 270 top
U6  -  [SOIC-8_L4.9-W3.9-P1.27-LS6.0-BL]  36.19 46.1 270 top
U7  -  [SOIC-8_L4.9-W3.9-P1.27-LS6.0-BL]  36.07 59.56 270 top
U8  -  [SOIC-8_L4.9-W3.9-P1.27-LS6.0-BL]  35.56 72.9 270 top
U9  -  [SOIC-8_L4.9-W3.9-P1.27-LS6.0-BL]  12.62 24.21 270 top
U10  -  [SOIC-8_L4.9-W3.9-P1.27-LS6.0-BL]  12.57 49.66 270 top
U11  -  [TSSOP-16_L5.0-W4.4-P0.65-LS6.4-TL]  80.97 71.2 90 top
U12  -  [SOIC-8_L4.9-W3.9-P1.27-LS6.0-BL]  13.88 75.65 270 top
U13  -  [TEST-SMD_L2.7-W1.0]  28.45 84.07 0 top
U14  -  [TEST-SMD_L2.7-W1.0]  19.05 31.88 0 top
U15  -  [TEST-SMD_L2.7-W1.0]  7.37 31.88 0 top
U16  -  [TEST-SMD_L2.7-W1.0]  19.18 59.69 0 top
U17  -  [TEST-SMD_L2.7-W1.0]  7.49 59.69 0 top
U18  -  [TEST-SMD_L2.7-W1.0]  92.46 69.22 0 top
U19  -  [TEST-SMD_L2.7-W1.0]  36.58 10.29 90 top
U21  AD8671ARZ-REEL7  [SOIC-8_L4.9-W3.9-P1.27-LS6.0-BL]  75.98 49.95 0 top
U22  -  [TEST-SMD_L2.7-W1.0]  90.92 55.37 270 top
U25  -  [TEST-SMD_L2.7-W1.0]  58.67 10.29 90 top
U26  -  [TEST-SMD_L2.7-W1.0]  72.9 78.99 0 top
U27  AD5721RBRUZ-RL7  [TSSOP-16_L5.0-W4.4-P0.65-LS6.4-BL]  83.44 28.32 180 top
U28  -  [SOIC-8_L4.9-W3.9-P1.27-LS6.0-BL]  84.6 43.14 180 top

## Footprints (pads in the part's own frame, mm; a bottom-side part is the same pattern mirrored in y, then rotated)
C0603
  rect 0.8x0.9 smd: 1(-0.7,0) 2(0.7,0)
CONN-TH_14P-P2.54_XKB_X9555WR-2X7-6TV01
  rect 1.6x1.6 hole 1.1: 1(7.62,1.27)
  round 1.6 hole 1.1: 2(7.62,-1.27) 3(5.08,1.27) 4(5.08,-1.27) 5(2.54,1.27) 6(2.54,-1.27) 7(0,1.27) 8(0,-1.27) 9(-2.54,1.27) 10(-2.54,-1.27) 11(-5.08,1.27) 12(-5.08,-1.27) 13(-7.62,1.27) 14(-7.62,-1.27)
HDR-TH_2P-P2.54-V-F
  rect 1.999x1.999 hole 1.199: 1(-1.27,0)
  round 1.999 hole 1.199: 2(1.27,0)
LED0603-R-RD
  rect 0.8x0.8 smd: 1(0.851,0) 2(-0.851,0)
Pad_e757
  round 7 hole 3.5: 1(0,0)
Pad_e761
  round 7 hole 3.5: 1(0,0)
Pad_e762
  round 7 hole 3.5: 1(0,0)
Pad_e763
  round 7 hole 3.5: 1(0,0)
R0603
  rect 0.807x0.864 smd: 1(-0.754,0) 2(0.754,0)
SMA-TH_KH-SMA-KE-Z
  round 2.499 hole 1.6: 1(-2.54,-2.54) 2(-2.54,2.54) 3(2.54,2.54) 4(2.54,-2.54) 5(0,0)
SOIC-8_L4.9-W3.9-P1.27-LS6.0-BL
  oval 0.59x2.045 smd: 1(-1.905,-2.771) 2(-0.635,-2.771) 3(0.635,-2.771) 4(1.905,-2.771) 5(1.905,2.773) 6(0.635,2.773) 7(-0.635,2.773) 8(-1.905,2.773)
TEST-SMD_L2.7-W1.0
  rect 3.429x1.78 smd: 1(0,0)
TSSOP-16_L5.0-W4.4-P0.65-LS6.4-BL
  oval 0.343x1.732 smd: 1(-2.275,-2.866) 2(-1.625,-2.866) 3(-0.975,-2.866) 4(-0.325,-2.866) 5(0.325,-2.866) 6(0.975,-2.866) 7(1.625,-2.866) 8(2.275,-2.866) 9(2.275,2.866) 10(1.625,2.866) 11(0.975,2.866) 12(0.325,2.866) 13(-0.325,2.866) 14(-0.975,2.866) 15(-1.625,2.866) 16(-2.275,2.866)
TSSOP-16_L5.0-W4.4-P0.65-LS6.4-TL
  rect 1.804x0.406 smd: 1(-2.999,2.276) 2(-2.999,1.625) 3(-2.999,0.976) 4(-2.999,0.325) 5(-2.999,-0.325) 6(-2.999,-0.976) 7(-2.999,-1.625) 8(-2.999,-2.276) 9(2.999,-2.276) 10(2.999,-1.625) 11(2.999,-0.976) 12(2.999,-0.325) 13(2.999,0.325) 14(2.999,0.976) 15(2.999,1.625) 16(2.999,2.276)

## Nets
As in the schematic, except:
AGND: C1.2 C2.2 C3.1 C4.1 C5.2 C6.2 C7.2 C8.2 C9.1 C10.1 C11.2 C12.2 C13.2 C14.2 C15.1 C16.1 C17.2 C18.2 C19.2 C20.2 C21.1 C22.1 C23.2 C24.2 C25.1 C26.1 C27.1 C28.1 C29.1 C30.1 C31.1 C32.1 C33.1 C34.1 C35.1 C36.1 C39.1 C42.2 C43.1 C44.2 C45.2 C46.1 C47.1 C48.1 C49.1 C51.2 C52.2 C53.1 C57.1 C58.1 C59.2 C60.2 C65.1 C66.1 C67.2 C68.2 C70.2 C72.2 C73.1 C74.1 C75.2 C76.2 C77.1 C78.1 C79.1 CN1.13 NOREF.1 NOREF#2.1 NOREF#3.1 NOREF#4.1 R11.1 R20.2 R33.2 R35.2 R36.2 RF1.1 RF1.2 RF1.3 RF1.4 RF2.1 RF2.2 RF2.3 RF2.4 RF3.1 RF3.2 RF3.3 RF3.4 RF4.1 RF4.2 RF4.3 RF4.4 RF5.1 RF5.2 RF5.3 RF5.4 RF6.1 RF6.2 RF6.3 RF6.4 RF7.1 RF7.2 RF7.3 RF7.4 RF8.1 RF8.2 RF8.3 RF8.4 RF9.1 RF9.2 RF9.3 RF9.4 RF10.1 RF10.2 RF10.3 RF10.4 U1.5 U1.16 U2.5 U2.16 U3.5 U3.16 U4.5 U4.16 U5.4 U6.4 U7.4 U8.4 U9.5 U10.5 U11.1 U11.3 U11.5 U11.8 U27.5 U27.16 U28.4

Pads without a net: CN1 12; U1 2 3 9 10 11; U2 2 3 9 10 11; U3 2 3 9 10 11; U4 2 3 9 10 11; U5 1 3 5 7 8; U6 1 3 5 7 8; U7 1 3 5 7 8; U8 1 3 5 7 8; U11 14 15; U12 1 5 8; U21 1 5 8; U27 2 3 9 10 11; U28 1 3 5 7 8

## Via types
v1: diameter 1.219, hole 0.61, Top Layer to Bottom Layer, 32 vias
v2: diameter 0.61, hole 0.305, Top Layer to Bottom Layer, 111 vias

## Routing (per net, layer and track width the routed paths; a pad name or vN(x,y) marks a point on that pad's centre or on a via; arc(x,y) is an arc through that point)
3V3: length 246.6
  Top Layer w0.254: R27.1 v2(49.66,34.93) ; R37.1 90.3,20.32 88.65,18.67 83.44,18.67 ; v2(83.19,80.77) R24.2 ; 85.03,25.46 C75.1 ; v2(49.66,75.82) R3.1 ; 59.69,61.92 59.82,61.79 ; R1.1 v2(49.53,49.15) ; R2.1 v2(49.66,62.87) ; v2(80.65,80.77) R25.2
  Top Layer w0.381: U4.15 56.17,70.84 C24.1 ; U3.15 58,59.16 ; U11.16 78.69,77.55 v2(78.74,77.6) ; U2.15 56.17,45.44 C12.1 C11.1 ; U1.15 58.33,31.09 C5.1
  Top Layer w0.508: v2(60.2,48.01) 59.06,49.15 v2(52.58,49.15) ; v2(60.2,48.01) 60.2,46.36 59.37,45.53 C11.1 ; v2(60.2,48.01) 60.2,50.17 59.82,50.55 v2(59.82,56.13) ; 60.2,33.78 v2(60.32,33.66) 60.32,32 59.5,31.18 C5.1 ; 60.2,33.78 v2(60.2,41.91) ; 60.2,33.78 59.06,34.93 v2(51.69,34.93) ; 59.69,62.23 59.06,62.87 v2(53.21,62.87) ; 59.69,62.23 59.82,62.36 59.82,64.39 60.2,64.77 v2(60.2,67.95) ; 59.69,62.23 59.82,62.1 v2(59.82,60.78) 59.82,59.82 59.12,59.12 C17.1 58,59.16 ; C75.1 C76.1 85.03,20.26 83.44,18.67 70.61,18.67 v2(62.74,26.54) ; v2(58.93,78.49) 56.26,75.82 ; 56.26,75.82 v2(53.59,75.82) ; 56.26,75.82 59.06,75.82 60.2,74.68 v2(60.2,72.62) 60.2,71.76 59.37,70.93 C23.1 58.23,70.87 56.32,70.87 C24.1 ; v2(78.74,77.6) 78.49,77.85 77.77,77.85 77.34,78.28 77.34,88.65 76.45,89.54 69.47,89.54 68.33,88.39 68.33,79.25 v2(67.56,78.49)
  Bottom Layer w0.254: v2(78.74,77.6) 78.74,78.87 v2(80.65,80.77) v2(83.19,80.77) ; v2(49.53,49.15) v2(52.58,49.15) ; v2(53.59,75.82) v2(49.66,75.82) ; v2(49.66,34.93) v2(51.69,34.93) ; v2(49.66,62.87) v2(53.21,62.87)
  Bottom Layer w0.508: v2(60.2,72.62) v2(60.2,67.95) ; v2(60.2,48.01) v2(60.2,41.91) ; CN1.14 61.59,87.25 61.59,81.15 v2(58.93,78.49) v2(67.56,78.49) ; v2(59.82,60.78) v2(59.82,56.13) ; v2(62.74,26.54) 62.74,31.24 v2(60.32,33.66)
+5V: length 11.5
  Top Layer w0.254: C52.1 76.26,65.51 LED5.1
  Top Layer w0.381: H3.2 75.69,70.51 75.69,68.71 76.26,68.13 C52.1 77.6,66.8 77.72,66.68 78.99,66.68 79.34,67.02 U11.2
+12V: length 451
  Top Layer w0.254: U27.8 81.16,32.18 C73.2 ; LED7.1 19.81,5.12 19.81,9.4 21.97,11.56 ; v2(94.74,46.99) 93.66,45.91 C77.2 ; 15.39,26.11 17.76,26.11
  Top Layer w0.381: C59.1 75.24,59.03 73.81,60.45 ; U3.8 47.92,55.25 46.74,55.25 46.35,54.86 45.4,54.86 C15.2 ; U4.8 48.04,66.93 45.64,66.93 ; U1.8 47.92,27.18 46.48,27.18 45.97,26.67 45.15,26.67 C4.2 ; U28.2 85.24,47.01 85.85,47.63 87.31,47.63 C78.2 ; U2.8 47.96,41.53 46.48,41.53 46.23,41.28 45.47,41.28
  Top Layer w0.508: C16.2 43.37,54.86 45.15,54.86 ; C59.1 75.35,57.29 U21.7 ; v2(28.19,31.88) 29.28,31.88 C26.2 ; 24.38,50.43 22.68,52.13 C46.2 17.21,51.56 U10.8 ; C35.2 30.67,73.53 U8.2 ; 21.27,76.33 C68.1 ; 21.27,76.33 22.73,76.33 24.38,74.68 v2(24.38,71.59) ; 21.27,76.33 21.22,76.28 U12.7 ; C77.2 C78.2 ; 30.99,46.67 31.05,46.74 U6.2 35.18,46.74 35.69,46.23 35.69,42.93 37.34,41.28 45.47,41.28 ; C4.2 45.07,26.62 C3.2 43.1,26.54 37.34,26.54 35.56,28.32 35.56,30.99 34.67,31.88 U5.2 31.3,31.88 C25.2 ; C73.2 C74.2 ; C34.2 27.24,73.6 v2(27.18,73.53) ; 33.3,60.2 31.05,60.2 C32.2 ; 43.31,66.93 45.34,66.93 ; 24.38,24.29 22.57,26.1 C43.2 ; 29.08,46.67 29.02,46.61 v2(27.81,46.61) ; C31.2 28,60.14 v2(27.94,60.2)
  Top Layer w0.635: 33.3,60.2 34.29,60.2 35.31,59.18 35.31,56.01 36.45,54.86 43.24,54.86 ; 43.18,66.93 37.97,66.93 34.8,70.1 34.8,72.77 34.04,73.53 U8.2
  Top Layer w0.762: 80.01,36.45 78.74,37.72 72.01,37.72 68.71,41.02 68.71,57.79 71.37,60.45 95,60.45 97.92,57.53 v2(97.92,50.17) 97.92,8.89 90.68,1.65 19.18,1.65 17.14,3.68 17.14,9.14 19.56,11.56 H1.2 ; 29.08,46.67 30.99,46.67 ; 80.02,36.45 C74.2 ; C31.2 C32.2 ; C34.2 30.54,73.6 ; C26.2 C25.2
  Top Layer w1.27: v2(24.38,71.59) v2(24.38,58.19) v2(24.38,44.51) v2(24.38,30.11) 24.38,17.91 22.86,16.38 H1.2
  Bottom Layer w0.254: v2(94.74,46.99) v2(97.92,50.17)
  Bottom Layer w0.508: v2(24.38,58.19) 26.39,60.2 v2(27.94,60.2) ; v2(28.19,31.88) 26.15,31.88 v2(24.38,30.11) ; v2(24.38,71.59) 24.38,72.01 25.91,73.53 v2(27.18,73.53) ; v2(24.38,44.51) 26.48,46.61 v2(27.81,46.61)
-12V: length 476
  Top Layer w0.254: C45.1 6.92,47.69 6.48,47.24 v2(6.48,46.86) ; LED6.2 42.8,5.37 42.8,10.41 44.07,11.68 ; U27.6 82.46,33.27
  Top Layer w0.381: 80.77,39.37 77.9,42.24 C58.2 ; v2(5.97,20.32) 5.97,21.08 7.18,22.29 ; 26.03,75.65 27.22,76.84 35.18,76.84 36.32,75.69 36.32,70.99 38.74,68.58 40.83,68.58 C20.1 ; U2.6 46.57,42.84 45.47,43.94 45.47,44 ; 26.03,61.98 27.69,63.63 35.05,63.63 36.83,61.85 36.83,57.28 37.85,56.26 42.1,56.26 C14.1 ; C1.1 45.15,29.08 46.23,29.08 46.82,28.49 U1.6 ; U3.6 46.12,56.56 C13.1 ; U4.6 46.31,68.24 45.21,69.34 C19.1
  Top Layer w0.508: C72.1 82.46,33.3 82.46,35.23 ; U21.4 77.9,47.17 C57.2 C58.2 ; 7.04,73.68 7.02,73.66 4.19,73.66 1.52,70.99 ; 7.04,73.68 8.55,73.68 8.61,73.74 U12.4 ; 7.04,73.68 6.64,73.68 ; 43.56,44 42.36,42.8 38.1,42.8 37.08,43.82 37.08,49.28 36.07,50.29 28.57,50.29 v2(28.07,50.8) ; C45.1 9.74,47.69 U10.4 ; v2(1.02,22.73) 1.02,26.92 1.52,27.43 1.52,28.83 ; 26.03,34.46 28.15,36.58 35.56,36.58 37.21,34.93 37.21,28.96 38.1,28.07 42.1,28.07 C2.1 ; C44.1 9.83,22.29 U9.4
  Top Layer w0.762: H2.2 42.42,11.68 40,9.27 40,4.57 41.15,3.43 89.92,3.43 96.52,10.03 96.52,47.37 95.12,48.77 82.42,48.77 80.77,47.12 80.77,39.37 82.42,37.72 ; C13.1 C14.1 ; C19.1 C20.1 ; 45.47,44 43.56,44 ; 82.46,37.72 82.46,35.23 ; C2.1 C1.1
  Top Layer w1.27: H2.2 44.96,14.1 42.42,16.64 28.96,16.64 26.03,19.56 v2(26.03,52.2) 26.03,77.47 22.73,80.77 5.21,80.77 1.52,77.09 v2(1.52,44.86) 1.52,28.83
  Bottom Layer w0.508: v2(26.03,52.2) 26.8,51.44 27.43,51.44 v2(28.07,50.8) ; v2(1.02,22.73) 1.02,20.32 1.91,19.43 5.08,19.43 v2(5.97,20.32) ; v2(6.48,46.86) 5.59,45.97 2.64,45.97 v2(1.52,44.86)
AGND: length 58.8
  Top Layer w0.254: U2.16 55.42,46.09 C12.2 v2(57.19,46.93) C11.2 ; U11.1 78.69,68.88 v2(78.1,69.47) ; C43.1 18.6,28.32 v2(18.67,28.32) ; v2(69.47,65.15) 69.47,64.27 R33.2 ; RF8.1 49.53,6.62 R35.2 ; C51.2 77.34,76.39 v2(77.34,75.57) ; 85.72,25.46 85.72,24 86.43,23.3 C75.2 ; C18.2 55.82,60.52 55.12,59.82 53.94,59.82 U3.16 ; C68.2 v2(20.31,77.75) C67.2 ; C46.1 18.48,54.23 v2(18.54,54.23) ; C72.2 83.11,32.5 U27.5 ; v2(82.68,47.5) 82.7,47.48 U28.4 ; C66.1 C65.1 ; RF7.1 27.33,7.14 R36.2 ; U1.16 55.68,31.74 C6.2
  Top Layer w0.381: U4.16 54.06,71.5 55.25,71.5 56.07,72.33 C24.2
  Top Layer w0.508: C79.1 86.82,38.18 v2(86.87,38.23) ; C5.2 v2(57.51,32.58) C6.2 ; C74.1 v2(78.62,34.25) C73.1 ; U10.5 16.13,47.75 v2(16.76,47.12) ; C58.1 v2(79.3,43.77) C57.1 ; C18.2 v2(57.11,60.52) C17.2 ; v2(57.28,72.39) 56.32,72.39 C24.2 C23.2 ; v2(86.43,19.43) C76.2 C75.2 ; C72.2 83.88,35.23 ; C60.2 C59.2 ; C78.1 C77.1
  vias: v1(7.49,89.54) v1(7.81,10.48) v1(8.25,91.31) v1(8.38,87.76) v1(8.57,12.26) v1(8.7,8.7) v1(10.16,92.08) v1(10.16,86.87) v1(10.48,13.02) v1(10.48,7.81) v1(11.94,91.44) v1(11.94,87.63) v1(12.26,12.38) v1(12.26,8.57) v1(12.7,89.54) v1(13.02,10.48) v1(86.8,89.6) v1(86.8,10.22) v1(87.57,91.38) v1(87.57,12) v1(87.69,87.82) v1(87.69,8.45) v1(89.47,92.14) v1(89.47,86.93) v1(89.47,12.76) v1(89.47,7.56) v1(91.25,91.5) v1(91.25,87.69) v1(91.25,12.13) v1(91.25,8.32) v1(92.01,89.6) v1(92.01,10.22) v2(3.3,21.84) v2(6.48,44.7) v2(7.29,44.7) v2(8,72.26) v2(8.89,19.69) v2(8.89,18.96) v2(28.32,33.4) v2(39.1,69.85) v2(39.88,69.85) v2(40.39,57.02) v2(42.3,58.16) v2(44.07,31.24) v2(44.58,45.34) v2(49.53,58.42) v2(49.53,57.62) v2(49.53,56.63) v2(49.66,70.23) v2(49.66,69.34) v2(49.66,68.51) v2(49.66,44.7) v2(49.66,43.9) v2(49.66,42.99) v2(49.91,29.72) v2(49.91,28.84) v2(49.91,27.91) v2(73.78,56.38) v2(74.68,65.66) v2(81.28,69.98) v2(82.04,69.98) v2(83.95,34.29) v2(90.04,44.58)
ADCIN: length 16
  Top Layer w0.254: U18.1 92.46,65.15 90.81,63.51 R26.2
  Top Layer w0.381: U18.1 92.46,75.08 RF6.5
BIAS_OUT: length 19.4
  Top Layer w0.254: U21.3 76.62,39.97 77.85,38.74 80.01,38.74 81.28,37.47 81.28,32.76 81.81,32.23 U27.7
CS1: length 52.9
  Top Layer w0.254: CN1.4 47.5,90.17 48.9,91.57 80.26,91.57 81.94,89.89 U11.11
CS2: length 119.2
  Top Layer w0.305: U27.13 83.76,24.2 82.42,22.86 75.31,22.86 64.77,33.4 v2(64.77,90.04)
  Bottom Layer w0.254: CN1.8 51.31,87.38 44.07,87.38 43.18,88.27 43.18,91.44 45.34,93.6 61.21,93.6 v2(64.77,90.04)
PZT_SLIDE: length 57.6
  Top Layer w0.381: U12.3 11.07,75.06 6.98,75.06 6.22,75.82 6.22,78.11 7.75,79.63 21.08,79.63 v2(23.75,76.96) ; v2(27.94,76.07) 34.67,76.07 35.56,75.18 35.56,70.66 38.25,67.97 45.82,67.97 46.2,67.59 U4.7
  Bottom Layer w0.381: v2(27.94,76.07) 24.64,76.07 v2(23.75,76.96)
PZT_SLIDE_OUT: length 8.5
  Top Layer w0.254: U12.2 11.1,76.29 R30.2
  Top Layer w0.508: U12.2 12.62,76.28 13.84,75.06 16.61,75.06 U12.6
SCLK: length 90.4
  Top Layer w0.254: CN1.9 55.12,83.69 61.21,77.6 v2(61.21,71.5) 59.18,69.47 56.13,69.47 55.41,70.19 U4.14 ; U3.14 55.16,58.51 55.88,57.79 59.06,57.79 v2(61.21,59.94) v2(61.21,68.96) ; v2(61.21,42.67) 61.21,31.37 59.69,29.85 56.01,29.85 55.41,30.44 U1.14 ; v2(61.21,57.02) v2(61.21,45.59) 59.69,44.07 56.13,44.07 55.42,44.79 U2.14
  Bottom Layer w0.254: v2(61.21,42.67) v2(61.21,45.59) ; v2(61.21,71.5) v2(61.21,68.96) ; v2(61.21,57.02) v2(61.21,59.94)
SCLK1: length 135.4
  Top Layer w0.254: CN1.6 50.04,89.92 51.05,90.93 80.14,90.93 81.53,89.54 81.53,77.22 81.29,76.97 U11.12
  Top Layer w0.305: 60.96,90.93 64.13,87.76 64.13,33.15 75.06,22.23 82.8,22.23 84.41,23.84 U27.14
SDI: length 93
  Top Layer w0.254: U4.12 60,68.89 62.1,70.99 ; 62.1,59.44 59.87,57.21 U3.12 ; 62.1,59.44 62.1,45.21 ; 62.1,59.44 62.1,70.99 ; U2.12 60.38,43.49 62.1,45.21 ; 62.1,45.21 62.1,30.61 60.63,29.14 U1.12 ; 62.1,70.99 62.1,78.49 57.66,82.93 CN1.11
SDI1: length 140.8
  Top Layer w0.254: CN1.2 44.96,90.3 46.99,92.33 v2(61.25,92.33) 80.65,92.33 82.35,90.63 82.35,77.16 82.59,76.92 U11.10
  Top Layer w0.305: v2(65.53,87.88) 65.53,33.66 75.69,23.5 82.17,23.5 83.11,24.44 U27.12
  Bottom Layer w0.254: 61.21,92.33 61.21,92.2 v2(65.53,87.88)
SDO1: length 44.8
  Top Layer w0.254: v2(67.06,86.11) 67.56,86.61 67.56,89.03 68.71,90.17 77.09,90.17 78.49,88.77 78.49,80.4 R25.1 ; v2(63.37,87.12) 60.32,90.17 56.64,90.17 CN1.10
  Top Layer w0.381: R25.1 80.64,78.24 U11.13
  Bottom Layer w0.254: v2(67.06,86.11) 64.39,86.11 v2(63.37,87.12)
SYNC1: length 61.5
  Top Layer w0.381: U1.13 52.78,29.79 50.55,32.03 50.55,81.92 48.77,83.69 47.37,83.69 CN1.1
SYNC2: length 45.3
  Top Layer w0.381: U2.13 52.82,44.14 51.31,45.65 51.31,82.3 CN1.3
SYNC3: length 30.5
  Top Layer w0.381: U3.13 52.78,57.86 51.94,58.7 51.94,82.8 50.04,84.71 CN1.5
SYNC4: length 17.8
  Top Layer w0.381: CN1.7 52.58,69.92 52.96,69.54 U4.13
VOLTAGE_OUT: length 8.9
  Top Layer w0.381: U21.6 76.57,52.68 76.57,49.78 75.35,48.56 U21.2
  Top Layer w0.508: U21.6 76.62,53.76 77.08,54.22 77.08,55.36 77.09,55.37
VREF1: length 11.9
  Top Layer w0.381: U5.6 41.21,30.61 C27.2 41.28,31.5 41.91,32.13 45.97,32.13 46.35,31.75 46.35,30.23 46.79,29.79 U1.4
VREF2: length 11.4
  Top Layer w0.254: U6.6 41.47,45.47 C30.2 42.61,46.48 46.23,46.48 46.61,46.1 46.61,44.45 46.92,44.14 U2.4
VREF3: length 11.5
  Top Layer w0.254: U7.6 41.21,58.93 C33.2 42.61,60.2 45.97,60.2 46.48,59.69 46.48,58.29 46.92,57.86 U3.4
VREF4: length 13.2
  Top Layer w0.381: U8.6 40.83,72.26 C36.2 41.84,73.15 45.85,73.15 46.48,72.52 46.48,69.85 46.79,69.54 U4.4
VREF5: length 10.4
  Top Layer w0.254: 83.97,40.36 C79.2 83.97,37.19 84.96,36.2 84.96,32.77 84.71,32.51 84.2,32.51 83.76,32.08 U27.4
XOUT: length 75.7
  Top Layer w0.381: U1.7 47.9,27.81 43.03,27.81 42.53,27.31 37.72,27.31 36.41,28.61 36.41,34.46 35.05,35.81 28.7,35.81 27.43,34.54 27.43,27.94 28.19,27.18 v2(28.19,24.13) ; v2(22.35,19.43) 22.34,19.44 R7.1 19.56,19.18 17.4,17.02 3.17,17.02 2.03,18.16 2.03,21.58 R12.1
  Bottom Layer w0.381: v2(22.35,19.43) 26.92,19.43 28.19,20.7 v2(28.19,24.13)
YOUT: length 58.8
  Top Layer w0.254: R21.2 2.67,47.69 2.67,44.45 3.68,43.43 15.87,43.43 R16.2 18.53,46.1 21.34,46.1 v2(22.99,47.75)
  Top Layer w0.381: U2.7 47.91,42.13 37.5,42.13 36.28,43.35 36.28,48.3 35.31,49.28 v2(28.19,49.28)
  Bottom Layer w0.381: v2(28.19,49.28) 24.51,49.28 v2(22.99,47.75)
Z+X: length 19.1
  Top Layer w0.508: R6.2 22.36,22.74 v2(22.86,23.24) ; RF2.5 U14.1 21.46,31.88 22.86,30.48 v2(22.86,27.43)
  Bottom Layer w0.508: v2(22.86,23.24) v2(22.86,27.43)
Z+Y: length 20.9
  Top Layer w0.508: v2(22.86,49.53) 22.11,48.78 R14.1 ; v2(22.86,53.34) 22.86,58.55 21.72,59.69 U16.1 RF4.5
  Bottom Layer w0.508: v2(22.86,49.53) v2(22.86,53.34)
Z-X: length 9.2
  Top Layer w0.508: R9.2 8.76,29.73 7.37,31.12 U15.1 RF3.5
Z-Y: length 11.2
  Top Layer w0.508: RF5.5 U17.1 7.49,57.02 8.76,55.76 R19.1
ZOUT: length 176.8
  Top Layer w0.254: R8.1 16.06,17.65 4.7,17.65 3.94,18.42 3.94,23.5 3.68,23.75 2.41,23.75 2.03,24.13 2.03,25.91 2.41,26.29 3.17,26.29 R13.1
  Top Layer w0.381: R17.2 19.56,43.82 18.67,42.93 4.06,42.93 2.79,41.66 2.79,32.39 3.17,32 R13.1 ; U3.7 46.13,55.91 45.89,55.67 37.04,55.67 36.07,56.64 36.07,61.21 34.67,62.61 28.19,62.61 27.05,61.47 27.05,45.34 27.94,44.45 v2(27.94,43.18)
  Top Layer w0.508: R22.2 3.68,58.55 3.05,59.18 3.05,69.47 4.19,70.61 12.06,70.61 13.33,69.34 13.33,46.36 v2(14.35,45.34) ; v2(22.99,42.42) 22.22,42.42 21.72,42.93 21.72,44.7 v2(21.08,45.34) 21.07,45.35 R17.2
  Bottom Layer w0.508: v2(27.94,43.18) 27.18,42.42 v2(22.99,42.42) ; v2(21.08,45.34) v2(14.35,45.34)
$1N1334: length 7.7
  Top Layer w0.254: LED1.2 42.07,34.38 43.56,32.89 47.12,32.89 47.93,32.08 U1.1
$1N4521: length 8.1
  Top Layer w0.254: LED2.2 42.16,49.11 42.16,47.75 42.8,47.12 47.24,47.12 47.96,46.4 U2.1
$1N6398: length 8.7
  Top Layer w0.254: LED4.2 42.16,75.44 43.69,73.91 46.99,73.91 48.05,72.85 U4.1
$1N6412: length 8.1
  Top Layer w0.254: LED3.2 42.07,61.81 42.93,60.96 47.37,60.96 47.93,60.4 U3.1
$1N17278: length 6.2
  Top Layer w0.254: R6.1 21.28,24.2 C37.2 19.5,24.25 R5.2 17.77,24.26 16.89,24.26 16.3,24.84 15.39,24.84
$1N17904: length 8.1
  Top Layer w0.254: C37.1 19.5,22.74 R5.1 ; 15.39,23.57 16.3,23.57 17.14,22.73 17.77,22.73 R5.1 ; R5.1 17.78,20.99 R8.2 19.5,20.93 19.54,20.89
$1N19975: length 7.4
  Top Layer w0.381: U9.1 7.41,26.11 R10.2 7.18,26.23 C38.2
  Top Layer w0.508: 7.25,26.29 R9.1
$1N22239: length 9.1
  Top Layer w0.381: R11.2 R12.2 5.53,23.57 U9.3
$1N23370: length 6.7
  Top Layer w0.381: U9.2 9.78,24.77 R10.1 7.18,24.83 C38.1 5.15,24.77 R13.2
$1N27431: length 6
  Top Layer w0.508: U10.7 21.33,50.29 R14.2
$1N27675: length 8.2
  Top Layer w0.508: U10.6 16.64,49.02 16.89,48.77 17.78,48.77 ; R17.1 C40.2 19.5,48.77 17.78,48.77 ; 17.78,48.77 R16.1 ; 17.78,48.77 R15.2
$1N29433: length 7.4
  Top Layer w0.508: R18.1 7.24,51.94 ; 7.24,51.94 8.01,51.94 8.38,51.56 U10.1 ; 7.24,51.94 7.24,54.86 R19.2
$1N29693: length 6.2
  Top Layer w0.508: U10.2 8.64,50.29 8.5,50.43 R18.2 R22.1
$1N31851: length 8.1
  Top Layer w0.381: 5.23,45.31 5.23,48.74 5.51,49.02 U10.3
$1N44864: length 1.8
  Top Layer w0.254: C47.2 79.38,63.48 R23.1
$1N45543: length 5.1
  Top Layer w0.254: U11.4 80.64,66.8 80.01,66.17 78.84,66.17 R23.2
$1N48445: length 5.4
  Top Layer w0.254: U11.6 81.94,66.7 81.41,66.17 81.41,65.03 C49.2 83.19,64.98 C48.2
$1N53852: length 6.7
  Top Layer w0.254: R26.1 87.07,64.97 C53.2 83.84,66.29 83.06,66.29 82.59,66.76 U11.7
$1N55555: length 4.1
  Top Layer w0.381: R24.1 83.24,78.18 83.24,74.2
$1N86130: length 2.3
  Top Layer w0.254: LED1.1 R27.2
$1N86342: length 2.3
  Top Layer w0.254: LED2.1 R1.2
$1N86554: length 2.5
  Top Layer w0.254: LED3.1 R2.2
$1N86766: length 2.4
  Top Layer w0.254: LED4.1 R3.2
$1N98330: length 28.8
  Top Layer w0.508: RF1.5 U13.1 19.05,84.07 v2(17.4,82.42) ; v2(13.59,78.61) 9.49,78.61 R30.1
  Bottom Layer w0.508: v2(13.59,78.61) v2(17.4,82.42)
$2N11015: length 13
  Top Layer w0.254: 78.59,55.37 91.56,55.37
$2N16241: length 14.2
  Top Layer w0.254: U19.1 36.51,10.22 RF7.5
  Top Layer w1.27: H1.1 24.38,9.02 25.53,10.16 29.81,10.16 RF7.5
$2N16244: length 14.2
  Top Layer w0.254: RF8.5 U25.1
  Top Layer w1.27: H2.1 47.12,9.14 48.26,10.29 RF8.5
$2N16819: length 13.1
  Top Layer w0.508: 72.9,85.09 U26.1 72.9,75.85 H3.1
$2N23862: length 2.3
  Top Layer w0.254: R33.1 LED5.2
$2N24958: length 2.2
  Top Layer w0.254: LED6.1 R35.1
$2N25511: length 2.2
  Top Layer w0.254: LED7.2 R36.1
$2N27101: length 2.8
  Top Layer w0.254: LED8.2 85.71,31.24
$2N28835: length 2.3
  Top Layer w0.254: R37.2 90.3,31.24

## Copper pours and planes (outline as drawn; the poured copper is in the pictures)
AGND on Top Layer: 1.78,23.62 16.76,23.62 16.76,18.16 1.78,18.16
AGND on Top Layer: 27.54,33.98 51.1,33.98 51.1,23.53 27.54,23.53
AGND on Top Layer: 2.96,47.98 8.51,47.98 8.51,43.94 2.96,43.94
AGND on Top Layer: 27.06,61.8 50.62,61.8 50.62,51.35 27.06,51.35
AGND on Top Layer: 26.94,48.02 50.51,48.02 50.51,37.58 26.94,37.58
AGND on Top Layer: 74.18,67.68 77.21,67.68 78.16,66.73 78.16,66.68 78.99,66.68 79.34,67.02 79.34,69.94 79.88,70.49 87.88,70.49 88.52,69.85 88.52,63.12 87.88,62.48 74.17,62.48 74.17,67.68
AGND on Top Layer: 27.18,74.68 50.74,74.68 50.74,64.23 27.18,64.23
AGND on Bottom Layer: -3.68,84.07 19.8,84.07 19.8,96.89 19.81,96.9 36.96,96.9 36.96,82.04 38.86,80.14 52.57,80.14 52.58,80.15 52.58,19.43 53.21,18.8 57.53,18.8 58.55,17.78 58.55,5.21 57.4,4.06 20.57,4.06 18.42,6.22 18.42,13.08 16.38,15.11 -3.68,15.11 -3.68,-1.14 103.25,-1.14 103.25,20.19 80.26,20.19 74.93,25.53 74.93,30.61 73.41,32.13 67.31,32.13 67.31,89.83 69.04,91.57 78.61,91.57 80.14,90.04 80.14,82.17 80.65,81.66 97.28,81.66 97.28,93.85 94.62,96.52 58.42,96.52 55.75,99.19 49.78,99.19 46.74,102.24 -3.68,102.24
AGND on Bottom Layer: 43.43,82.8 44.83,82.8 44.83,77.6 43.43,77.6
AGND on Bottom Layer: 75.82,78.36 78.99,78.36 80.39,76.96 80.39,72.26 79.38,71.25 79.38,67.06 78.99,66.68 78.05,66.68 77.6,67.13 77.6,74.3 75.82,76.07
AGND on Bottom Layer: 66.68,36.32 68.96,36.32 68.96,35.69 66.68,35.69
AGND on Bottom Layer: -3.68,83.19 20.57,83.19 20.57,95.89 20.45,96.01 35.94,96.01 35.94,81.53 38.23,79.25 51.29,79.25 51.31,79.27 51.31,18.92 52.32,17.91 56.77,17.91 57.91,16.76 57.91,5.84 56.77,4.7 21.34,4.7 19.05,6.99 19.05,14.61 18.16,15.49 -3.68,15.49
AGND on Bottom Layer: 75.82,78.36 77.34,78.36 79.76,80.77 79.76,88.65 84.58,88.65 87.12,86.11 87.12,73.03 86.61,72.52 77.65,72.52 77.63,72.49 77.6,72.52 77.6,74.3 75.82,76.07
AGND on Bottom Layer: 66.29,62.48 68.83,62.48 68.83,61.98 66.29,61.98
AGND on Bottom Layer: 68.33,85.28 68.33,89.03 69.85,90.55 77.72,90.55 79.12,89.15 79.12,80.77 77.09,78.74 75.31,78.74 75.31,75.95 76.84,74.42 76.84,67.31 77.85,66.29 79.12,66.29 79.63,66.8 79.63,70.99 80.9,72.26 87.25,72.26 87.38,72.39 87.38,80.65 97.28,80.65 97.28,66.29 92.97,61.98 68.45,61.98 68.45,85.15
AGND on Bottom Layer: 68.45,61.34 96.9,61.34 100.46,57.79 100.46,27.18 75.41,27.18 75.41,30.89 73.66,32.64 68.33,32.64 68.33,61.21

## Text on the board
Bottom Silkscreen Layer: ±12V/+5V/+3.3V(Digital) | PWR IN: | DA OUT: | ±10V(16bit)/±10V(12bit) | Z+X/Z-X/Z+Y/Z-Y (16bit) | OPAMP: | ±12.288V(16bit) | AD IN: | AD5761/ADS8685/AD5722 | CONTROL_BOARD
Top Silkscreen Layer: SDI1 | CS1 | CLK1 | CS2 | SDO1 | LDAC | 3V3 | SY1| SY2 | SY3 | SY4 | CLK | SDI | GND | Z-X | Z-Y | Z+X | Z+Y | 16Bit-DAC | +12V IN | -12V IN | +5V IN | 12Bit-DAC | ADC_IN
